# EasyEDA Pro project STM32-Environment-Monitor-V1.2.epro

# Schematic Schematic1

## Sheets
1 P1: Assembly Variant: Basic; Board Name: Board1; Create Date: 2026-11-14; Page Name: P1; Project Name: 基于STM32的多功能环境智能监控系统; Schematic Name: Schematic1; Update Date: 2026-11-14; Company: 嘉立创EDA; Page Size: A4; Version: V1.0
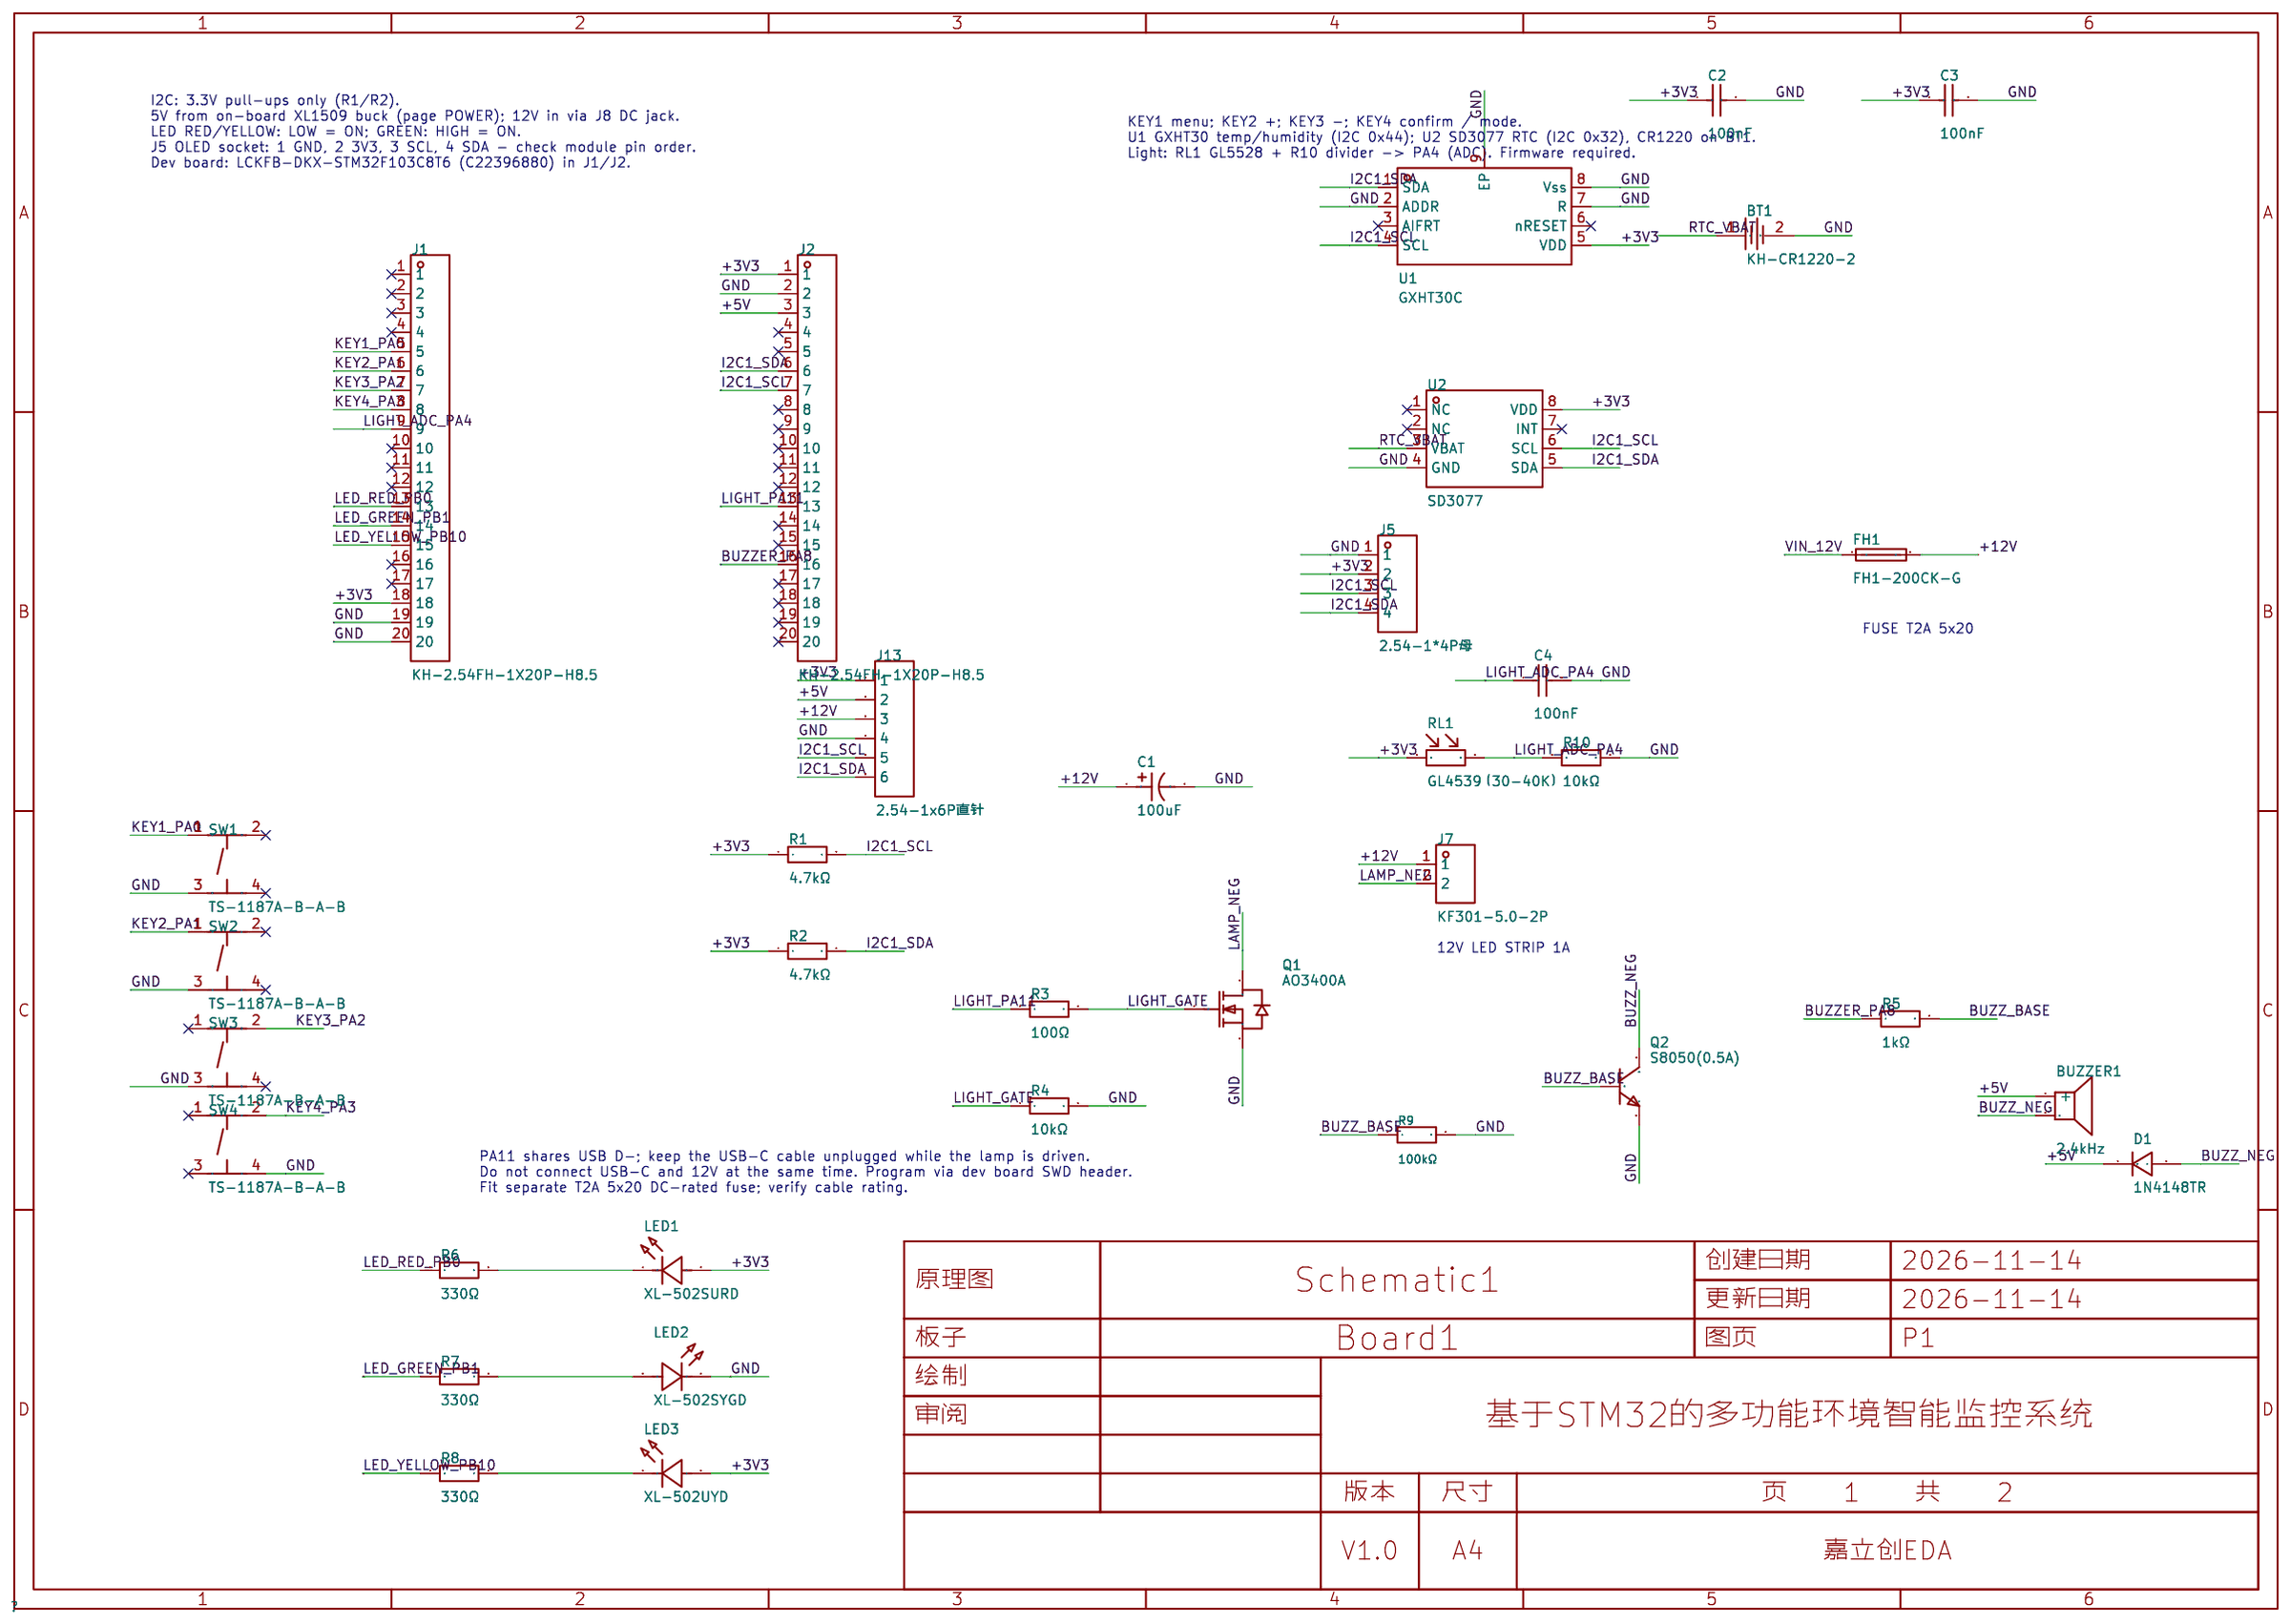
[diagram p0: P1]
2 POWER: Create Date: 2026-11-13; Page Name: POWER; Update Date: 2026-11-13
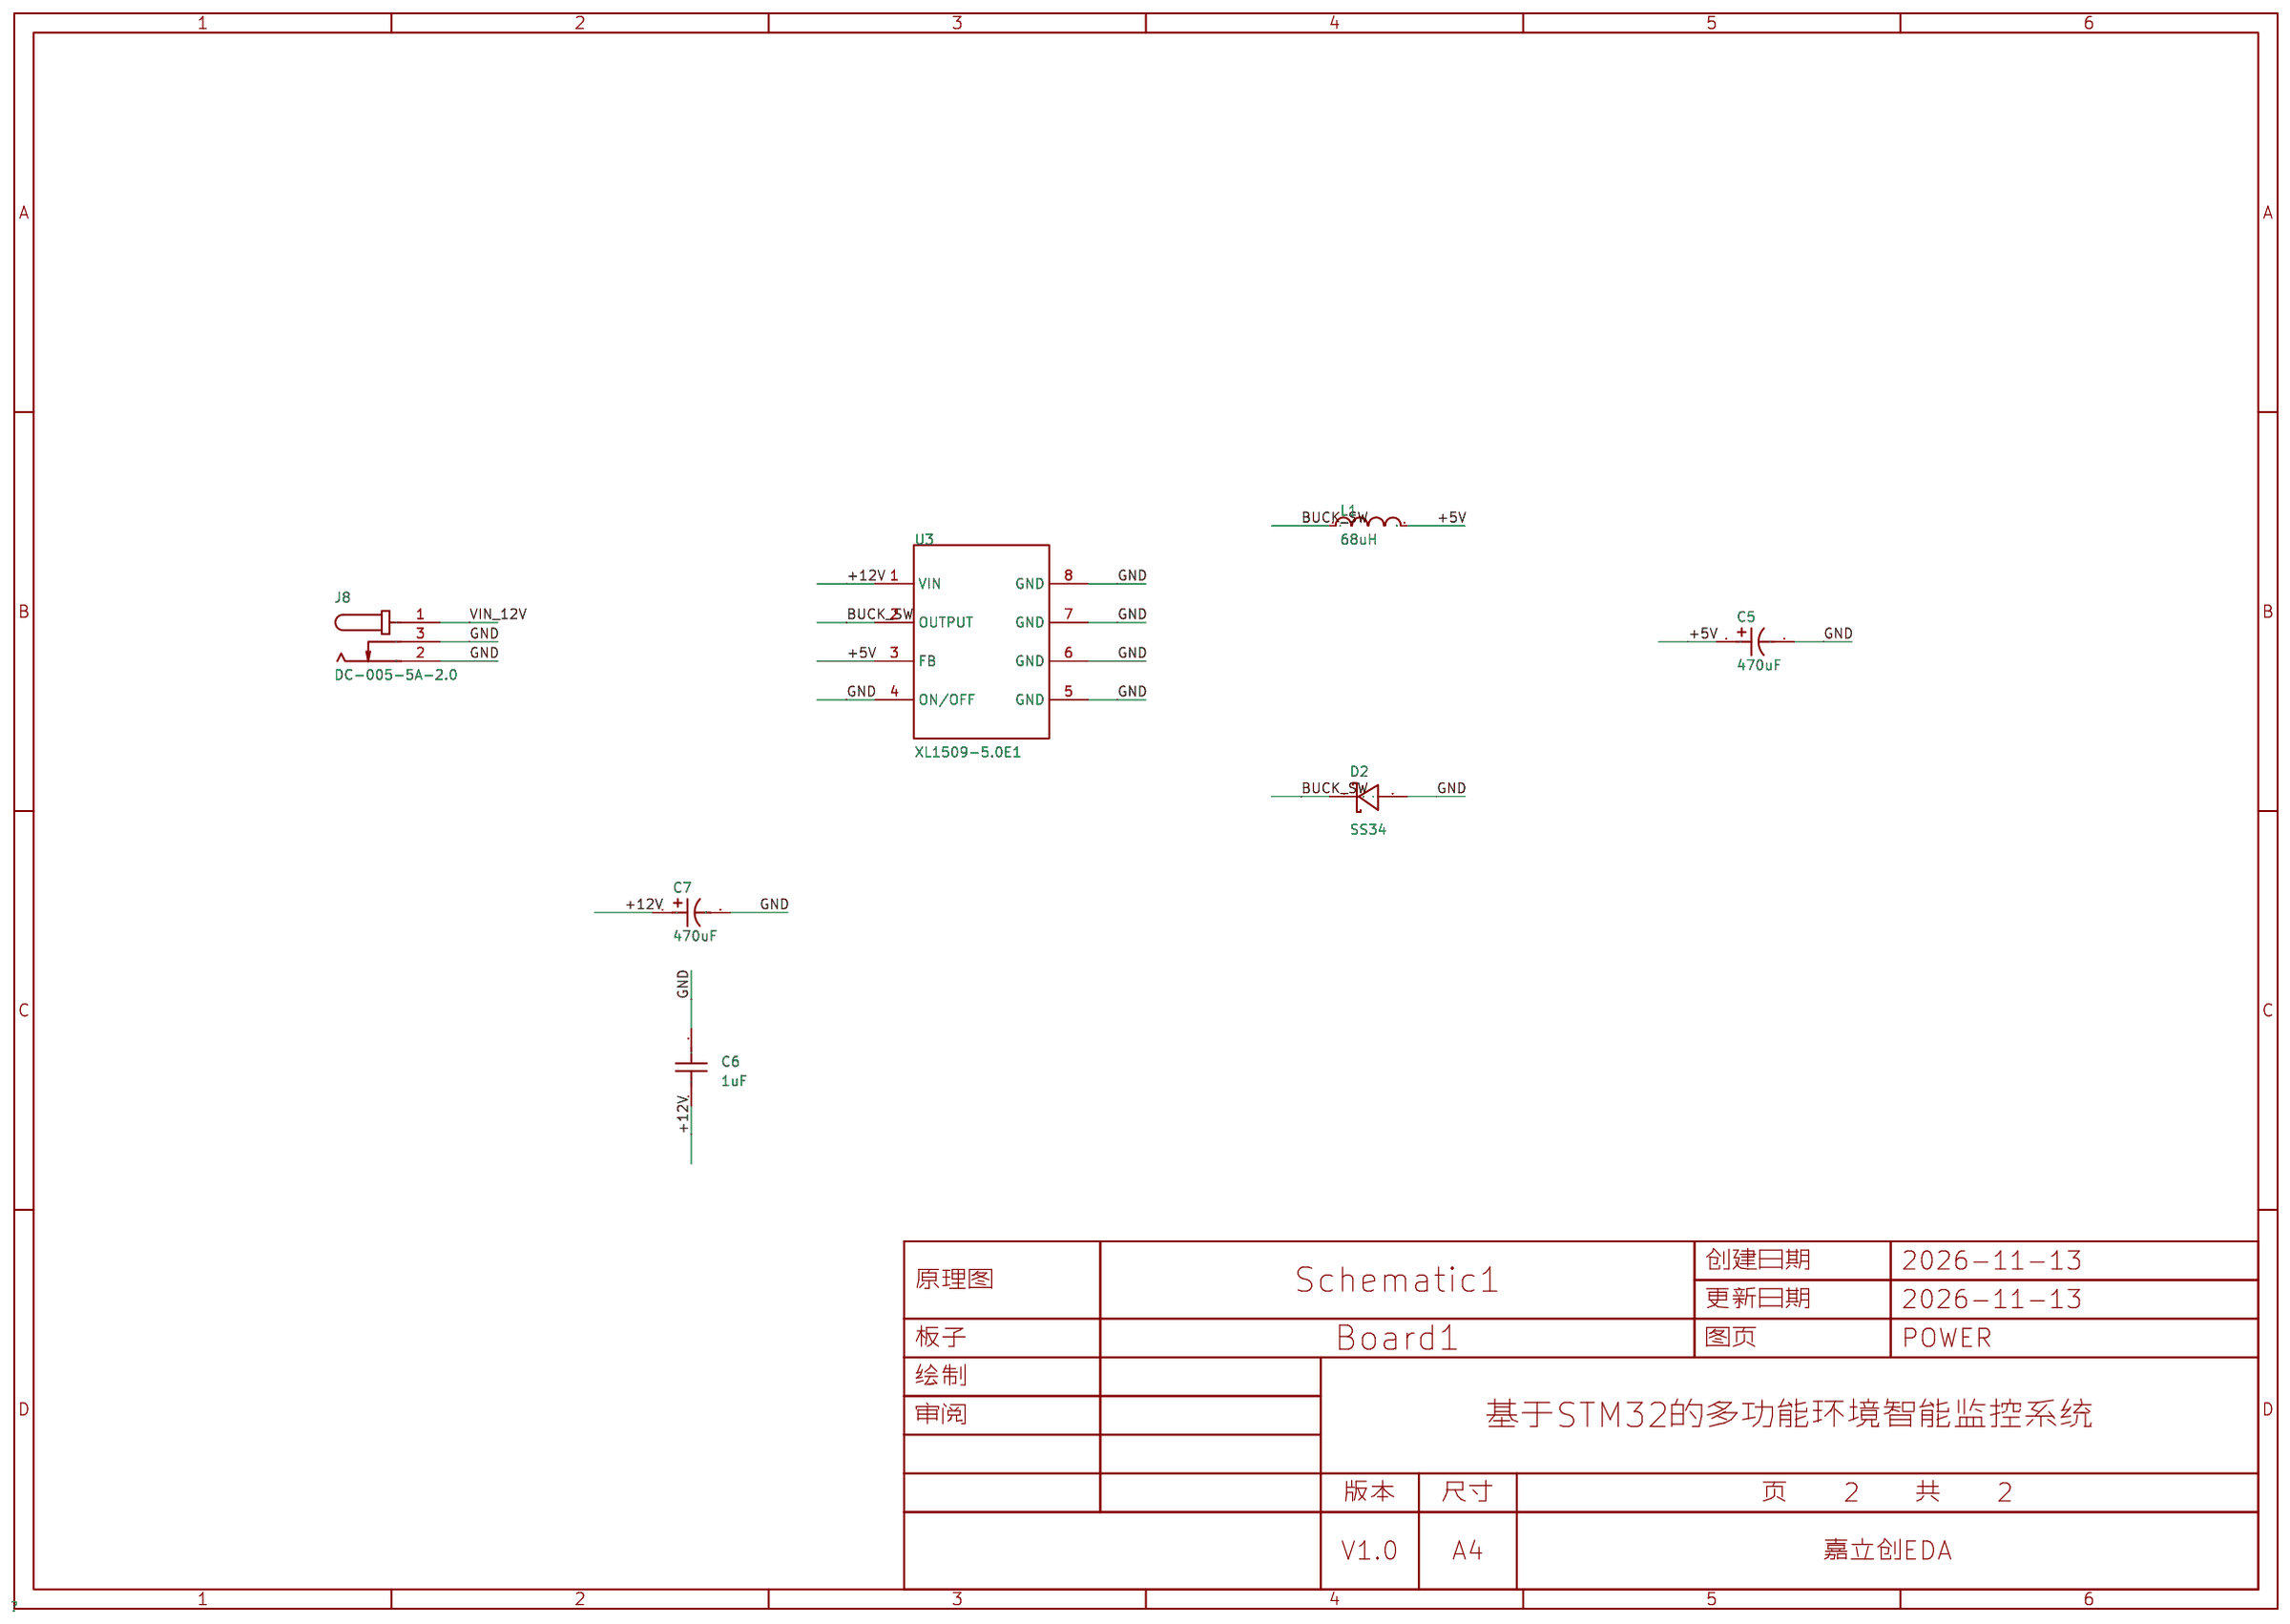
[diagram p1: POWER]

## Parts
sheet P1
BT1  KH-CR1220-2  [BAT-SMD_CR1220-2]
BUZZER1  2.4kHz  [BUZ-TH_BD12.0-P7.60-D0.6-FD]
C1  100uF  [CAP-TH_BD6.3-P2.50-D0.5-FD]
C2  100nF  [C0603]
C3  100nF  [C0603]
C4  100nF  [C0603]
D1  1N4148TR  [DO-35_BD2.0-L4.2-P8.20-D0.5-RD]
FH1  FH1-200CK-G  [FUSE-TH_L24.8-W9.8-P22.60]
J1  KH-2.54FH-1X20P-H8.5  [HDR-TH_20P-P2.54-V-F-2]
J2  KH-2.54FH-1X20P-H8.5  [HDR-TH_20P-P2.54-V-F-2]
J5  2.54-1*4P母  [HDR-TH_4P-P2.54-V-F]
J7  KF301-5.0-2P  [CONN-TH_P5.00_KF301-5.0-2P]
J13  2.54-1x6P直针  [HDR-TH_6P-P2.54-V-M-1]
LED1  XL-502SURD  [LED-TH_BD5.9-P2.54-RD_RED]
LED2  XL-502SYGD  [LED-TH_BD5.8-P2.54-RD]
LED3  XL-502UYD  [LED-TH_BD5.9-P2.54-RD_YELLOW]
Q1  AO3400A  [SOT-23-3_L2.9-W1.3-P1.90-LS2.4-BR]
Q2  S8050(0.5A)  [SOT-23-3_L2.9-W1.3-P1.90-LS2.4-BR]
R1  4.7kΩ  [R0603]
R2  4.7kΩ  [R0603]
R3  100Ω  [R0603]
R4  10kΩ  [R0603]
R5  1kΩ  [R0603]
R6  330Ω  [R0603]
R7  330Ω  [R0603]
R8  330Ω  [R0603]
R9  100kΩ  [R0603]
R10  10kΩ  [R0603]
RL1  GL4539（30-40K）  [CAP-TH_BD6.3-P2.50-D0.5-FD]
SW1  TS-1187A-B-A-B  [SW-SMD_4P-L5.1-W5.1-P3.70-LS6.5-TL_H1.5]
SW2  TS-1187A-B-A-B  [SW-SMD_4P-L5.1-W5.1-P3.70-LS6.5-TL_H1.5]
SW3  TS-1187A-B-A-B  [SW-SMD_4P-L5.1-W5.1-P3.70-LS6.5-TL_H1.5]
SW4  TS-1187A-B-A-B  [SW-SMD_4P-L5.1-W5.1-P3.70-LS6.5-TL_H1.5]
U1  GXHT30C  [DFN-8_L2.5-W2.5-P0.50-BL-EP]
U2  SD3077  [SOIC-8_L5.3-W5.3-P1.27-LS8.0-BL]
sheet POWER
C5  470uF  [CAP-SMD_BD10.0-L10.3-W10.3-LS11.3-FD]
C6  1uF  [C0805]
C7  470uF  [CAP-SMD_BD10.0-L10.3-W10.3-LS11.3-FD]
D2  SS34  [SMA_L4.3-W2.6-LS5.0-RD]
J8  DC-005-5A-2.0  [DC-IN-TH_DC-005-5A-2.0]
L1  68uH  [IND-SMD_L8.0-W8.0_SMNR8040]
U3  XL1509-5.0E1  [SOIC-8_L5.0-W4.0-P1.27-LS6.0-BL]

## Library data of the parts
BT1 = KH-CR1220-2: PPS BS-1220-2贴片正负极带孔6号模; Supplier Part: C5365933; Manufacturer: kinghelm(金航标); JLCPCB Part Class: 扩展库; Datasheet: https://atta.szlcsc.com/upload/public/pdf/source/20230301/1E62885793E6CFB75C333AA3D0BD606A.pdf; Supplier: LCSC; PCB Layer: Default
BUZZER1 = TMB12A05_C96093: 驱动方式:有源(内含驱动线路);构造类型:电磁式;额定电压:5V;频率:2.4kHz;声压(SPL):85dB;; LCSC Part Name: 有源(内含驱动线路) 电磁式 2.4kHz; Supplier Part: C96093; Manufacturer: 华能; Manufacturer Part: TMB12A05; Supplier Footprint: 插件,D=12mm; JLCPCB Part Class: Extended Part; Datasheet: https://item.szlcsc.com/datasheet/TMB12A05/97297.html; Supplier: LCSC; Driver Circuitry: 有源(内含驱动线路); Technology: 电磁式; Voltage Rating: 5V; Voltage - Supply: 4V~8V; Current Consumption: 30mA; Sound Pressure Level(SPL): 85dB; Diameter(φD): 12mm; Height: 9.8mm; Operating Temperature: -40℃~+85℃; Mounting Type: 插件
C1 = ERG25V100M6X7: 容值:100uF;精度:±20%;额定电压:25V;纹波电流:205mA@100kHz;等效串联电阻(ESR):600mΩ@100kHz;; LCSC Part Name: 100uF ±20% 25V; Supplier Part: C48935385; Manufacturer: JIERR(捷而瑞); Supplier Footprint: 插件,D6.3xL7mm; JLCPCB Part Class: Extended Part; Datasheet: https://item.szlcsc.com/datasheet/ERG25V100M6X7/51248505.html; Supplier: LCSC; Tolerance: ±20%; Voltage Rating: 25V; Ripple Current: 205mA@100kHz; Equivalent Series Resistance(ESR): 600mΩ@100kHz; Pin Spacing: 2.5mm; Diameter: 6.3mm; Height - Seated (Max): 7mm; Lifetime: 2000hrs@105℃; Operating Temperature: -40℃~+105℃; Polarity type: 有极性
C2-C4 = 0603B104K500NT: 容值:100nF;精度:±10%;额定电压:50V;材质(温度系数):X7R;; LCSC Part Name: 100nF ±10% 50V; Supplier Part: C30926; Manufacturer: FH(风华); Supplier Footprint: 0603; JLCPCB Part Class: Extended Part; Datasheet: https://atta.szlcsc.com/upload/public/pdf/source/20170923/C30926_1506149436298988724.pdf; Supplier: LCSC; Tolerance: ±10%; Voltage Rated: 50V; Temperature Coefficient: X7R; PCB Layer: Default
D1 = 1N4148TR_C84410: 二极管配置:1个独立式;整流电流:200mA;直流反向耐压(Vr):100V;正向压降(Vf):1V@10mA;反向恢复时间(Trr):4ns;; LCSC Part Name: 100V 200mA; Supplier Part: C84410; Manufacturer: onsemi(安森美); Supplier Footprint: DO-35; JLCPCB Part Class: Extended Part; Datasheet: https://item.szlcsc.com/datasheet/1N4148TR/85580.html; Supplier: LCSC; Diode Configuration: 1个独立式; Pd - Power Dissipation: 500mW; Current - Rectified: 200mA; Voltage - DC Reverse(Vr): 100V; Voltage - Forward(Vf@If): 1V@10mA; Non-Repetitive Peak Forward Surge Current: 4A; Reverse Leakage Current (Ir): 5uA@75V; Reverse Recovery Time (trr): 4ns; Operating Junction Temperature Range: -55℃~+175℃@(Tj)
FH1 = FH1-200CK-G: 保险丝座类型:-;保险丝类型:-;; LCSC Part Name: 两件套 保险丝夹5*20绿色（两件套）; Supplier Part: C268204; Manufacturer: HONGJU(宏聚); Supplier Footprint: 插件,P=22.6mm; JLCPCB Part Class: Extended Part; Datasheet: https://item.szlcsc.com/datasheet/FH1-200CK-G/257711.html; Supplier: LCSC; PCB Layer: Default
J1 J2 = KH-2.54FH-1X20P-H8.5: 插孔结构:1x20P;间距:2.54mm;行距:-;圆孔/方孔:方孔;安装方式:直插;排数:单排;总孔位数:20P;额定电流:3A;额定电压:-;插孔方向:顶部;塑高:8.5mm;触头材质:黄铜;触头镀层:金;工作温度:-40℃~+105℃;; LCSC Part Name: 1x20P 间距:2.54mm 直插; Supplier Part: C2905423; Manufacturer: kinghelm(金航标); Supplier Footprint: 插件,P=2.54mm; JLCPCB Part Class: Extended Part; Datasheet: https://item.szlcsc.com/datasheet/KH-2.54FH-1X20P-H8.5/3175197.html; Supplier: LCSC; Holes Structure: 1x20P; Pitch: 2.54mm; Circular Hole / Square Hole: 方孔; Mounting Type: 直插; Number of Rows: 单排; Number of Positions: 20P; Current Rating: 3A; Holes Direction: 顶部; Insulation Height: 8.5mm; Contact Material: 黄铜; Contact Plating: 金; Operating Temperature: -40℃~+105℃; PIN Length: 3mm
J5 = 2.54-1*4P母: 排数:单排;总孔位数:4P;间距:2.54mm;插孔结构:1x4P;行距:-;安装类型:直插;圆孔/方孔:方孔;额定电流:3A;额定电压:-;插孔方向:顶部;塑高:-;触头材质:青铜;触头镀层:-;工作温度范围:-40℃~+105℃;焊接温度(最大值):-;; LCSC Part Name: 间距:2.54mm 1x4P 直插; Supplier Part: C2718488; Manufacturer: BOOMELE(博穆精密); Supplier Footprint: 插件,P=2.54mm; JLCPCB Part Class: Extended Part; Datasheet: https://atta.szlcsc.com/upload/public/pdf/source/20210301/C2718488_F4427B881E42CAA8DDB0B1C12B3A522C.pdf; Supplier: LCSC; Number of Rows: 单排; Number of Holes: 4P; Pitch: 2.54mm; Holes Structure: 1x4P; Mounting Type: 直插; Circular Hole / Square Hole: 方孔; Current Rating (Max): 3A; Holes Direction: 顶部; Contact Material: 青铜; Operating Temperature Range: -40℃~+105℃; PCB Layer: Default
J7 = KF301-5.0-2P: 结构:1x2P;间距:5mm;颜色:蓝色;安装类型:直插;排数:1;每排PIN数:2;额定电流:17A;额定电压:250V;线规 - AWG:14~22;线规 - 平方毫米:1.5;工作温度:-30℃~+120℃;; LCSC Part Name: 1x2P 5mm 直插 排数:1 每排P数:2; Supplier Part: C474881; Manufacturer: KEFA(科发); Supplier Footprint: 插件,P=5mm; JLCPCB Part Class: Extended Part; Datasheet: https://item.szlcsc.com/datasheet/KF301-5.0-2P/481499.html; Supplier: LCSC; Number of Positions or Pins: 1x2P; Pitch: 5mm; Color: 蓝色; Mounting Type: 直插; Number of Pins: 2P; Number of Rows: 1; Number of PINs Per Row: 2; Screw Specification: M2.5; Current Rating: 17A; Voltage Rating (Max): 250V; Wire Gauge - AWG: 14~22; Wire Gauge - mm2: 1.5; Operating Temperature: -30℃~+120℃; Height Above Board: 10mm; PCB Layer: Default
J13 = 2.54-1x6P直针: 插针结构:1x6P;间距:2.54mm;行距:-;圆针/方针:方针;安装方式:直插;排数:单排;总PIN位数:6P;额定电流:3A;额定电压:-;配合针长度:5.7mm;塑高:2.5mm;端接针长度:3mm;触头材质:黄铜;触头镀层:金;工作温度:-40℃~+105℃;颜色:黑色;; LCSC Part Name: 1x6P 间距:2.54mm 方针 直插; Supplier Part: C37208; Manufacturer: BOOMELE(博穆精密); Supplier Footprint: 插件,P=2.54mm; JLCPCB Part Class: Extended Part; Datasheet: https://item.szlcsc.com/datasheet/2.54-1x6P%25E7%259B%25B4%25E9%2592%2588/38187.html; Supplier: LCSC; Pin Structure: 1x6P; Pitch: 2.54mm; Circluar Pins/Square Pins: 方针; Mounting Type: 直插; Number of Rows: 单排; Number of Pins: 6P; Current Rating: 3A; Length of Mating Pin: 5.7mm; Insulation Height: 2.5mm; Length of End Connection Pin: 3mm; Contact Material: 黄铜; Contact Plating: 金; Operating Temperature: -40℃~+105℃; Color: 黑色
LED1 = XL-502SURD: 灯头类型:5mm圆形灯头;发光颜色:红色;正向压降(Vf):2.4V;功率:70mW;测试电流:20mA;波长:615nm~625nm;二极管配置:-;透镜颜色:红色透镜;色温:-;发光强度:300mcd;发光角度:35°;载带方式:-;工作温度:-25℃~+85℃;; LCSC Part Name: 5mm圆形灯头 红色; Supplier Part: C2895492; Manufacturer: XINGLIGHT(成兴光); Supplier Footprint: 插件,D=5mm; JLCPCB Part Class: Extended Part; Datasheet: https://item.szlcsc.com/datasheet/XL-502SURD/3136207.html; Supplier: LCSC; Lamp Holder Type: 5mm圆形灯头; Illumination Color: 红色; Voltage - Forward(Vf): 2.4V; Power(Watts): 70mW; Test Current: 20mA; Wavelength - Dominant: 615nm~625nm; Peak Wavelength: 654nm; Lens Color: 红色透镜; Luminous Intensity: 300mcd; Viewing Angle: 35°; Operating Temperature: -25℃~+85℃
LED2 = XL-502SYGD: 灯头类型:5mm圆形灯头;发光颜色:黄绿色;正向压降(Vf):2.3V;功率:50mW;正向电流:20mA;波长:560nm~580nm;二极管配置:-;透镜颜色:绿色透镜;色温:-;发光强度:300mcd;发光角度:25°;载带方式:-;工作温度:-20℃~+85℃;; LCSC Part Name: 绿发普绿短脚; Supplier Part: C2895550; Manufacturer: XINGLIGHT(成兴光); Supplier Footprint: 插件,D=5mm; JLCPCB Part Class: Extended Part; Datasheet: https://item.szlcsc.com/datasheet/XL-502SYGD/3136215.html; Supplier: LCSC; Lamp Holder Type: 5mm圆形灯头; Illumination Color: 黄绿色; Voltage - Forward(Vf): 2.3V; Power(Watts): 50mW; Forward Current: 20mA; Wavelength - Dominant: 560nm~580nm; Peak Wavelength: 570nm; Lens Color: 绿色透镜; Luminous Intensity: 300mcd; Viewing Angle: 25°; Operating Temperature: -20℃~+85℃
LED3 = XL-502UYD: 灯头类型:5mm圆形灯头;发光颜色:黄色;正向压降(Vf):2.2V;功率:50mW;正向电流:20mA;波长:585nm~595nm;二极管配置:-;透镜颜色:黄色透镜;色温:-;发光强度:1cd;发光角度:25°;载带方式:-;工作温度:-20℃~+85℃;; LCSC Part Name: 5mm圆形灯头 黄色; Supplier Part: C2895494; Manufacturer: XINGLIGHT(成兴光); Supplier Footprint: 插件,D=5mm; JLCPCB Part Class: Extended Part; Datasheet: https://item.szlcsc.com/datasheet/XL-502UYD/3136209.html; Supplier: LCSC; Lamp Holder Type: 5mm圆形灯头; Illumination Color: 黄色; Voltage - Forward(Vf): 2.2V; Power(Watts): 50mW; Forward Current: 20mA; Wavelength - Dominant: 585nm~595nm; Peak Wavelength: 588nm; Lens Color: 黄色透镜; Luminous Intensity: 1cd; Viewing Angle: 25°; Operating Temperature: -20℃~+85℃
Q1 = AO3400A_C20917: 数量:1个N沟道;漏源电压(Vdss):30V;连续漏极电流(Id):5.7A;导通电阻(RDS(on)):48mΩ@2.5V;耗散功率(Pd):1.4W;阈值电压(Vgs(th)):1.45V;; LCSC Part Name: N沟道 耐压:30V; Supplier Part: C20917; Manufacturer: AOS; Supplier Footprint: SOT-23; JLCPCB Part Class: Basic Part; Datasheet: https://item.szlcsc.com/datasheet/AO3400A/21629.html; Supplier: LCSC; Number: 1个N沟道; Drain to Source Voltage: 30V; Current - Continuous Drain(Id): 5.7A; RDS(on): 48mΩ@2.5V; Pd - Power Dissipation: 1.4W; Gate Threshold Voltage (Vgs(th)): 1.45V; Gate Charge(Qg): 7nC@10V; Input Capacitance(Ciss): 630pF; Reverse Transfer Capacitance (Crss@Vds): 50pF; Operating Temperature: -55℃~+150℃; Type: N沟道; Output Capacitance(Coss): 75pF; Vgs: ±12V
Q2 = S8050(0.5A): 晶体管类型:NPN;集电极电流(Ic):500mA;集射极击穿电压(Vceo):25V;耗散功率(Pd):300mW;直流电流增益(hFE):120;; LCSC Part Name: 电流:0.5A 电压:25V; Supplier Part: C3014350; Manufacturer: EIC; Supplier Footprint: SOT-23; JLCPCB Part Class: Extended Part; Datasheet: https://item.szlcsc.com/datasheet/S8050(0.5A)/3524496.html; Supplier: LCSC; type: NPN; Current - Collector(Ic): 500mA; Collector - Emitter Voltage VCEO: 25V; Pd - Power Dissipation: 300mW; DC Current Gain: 120; Transition frequency(fT): 150MHz; Current - Collector Cutoff: 100nA; Vce Saturation(VCE(sat)): 600mV; Emitter-Base Voltage(Vebo): 5V; Number: 1个NPN; Configuration: 独立式
R1 R2 = 0603WAF4701T5E: 电阻类型:厚膜电阻;阻值:4.7kΩ;精度:±1%;功率:100mW;工作电压:75V;温度系数:±100ppm/℃;; LCSC Part Name: 厚膜电阻 4.7kΩ ±1%; Supplier Part: C23162; Manufacturer: UNI-ROYAL(厚声); Supplier Footprint: 0603; JLCPCB Part Class: Basic Part; Datasheet: https://item.szlcsc.com/datasheet/0603WAF4701T5E/23889.html; Supplier: LCSC; Type: 厚膜电阻; Tolerance: ±1%; Power(Watts): 100mW; Voltage-Supply(Max): 75V; Temperature Coefficient: ±100ppm/℃; Operating Temperature: -55℃~+155℃
R3 = 0603WAF1000T5E: 电阻类型:厚膜电阻;阻值:100Ω;精度:±1%;功率:100mW;最大工作电压:75V;温度系数:±200ppm/℃;; LCSC Part Name: 100Ω ±1% 100mW 厚膜电阻; Supplier Part: C22775; Manufacturer: UNI-ROYAL(厚声); Supplier Footprint: 0603; JLCPCB Part Class: Basic Part; Datasheet: https://atta.szlcsc.com/upload/public/pdf/source/20200306/C422600_1E6D84923E4A46A82E41ADD87F860B5C.pdf; Supplier: LCSC; Type: 厚膜电阻; Tolerance: ±1%; Power(Watts): 100mW; Overload Voltage (Max): 75V; Temperature Coefficient: ±200ppm/℃; Operating Temperature Range: -55℃~+155℃
R4 = 0603WAF1002T5E: 电阻类型:厚膜电阻;阻值:10kΩ;精度:±1%;功率:100mW;工作电压:75V;温度系数:±100ppm/℃;; LCSC Part Name: 厚膜电阻 10kΩ ±1% 100mW; Supplier Part: C25804; Manufacturer: UNI-ROYAL(厚声); Supplier Footprint: 0603; JLCPCB Part Class: Basic Part; Datasheet: https://item.szlcsc.com/datasheet/0603WAF1002T5E/26547.html; Supplier: LCSC; Type: 厚膜电阻; Tolerance: ±1%; Power(Watts): 100mW; Voltage-Supply(Max): 75V; Temperature Coefficient: ±100ppm/℃; Operating Temperature: -55℃~+155℃
R5 = 0603WAF1001T5E: 电阻类型:厚膜电阻;阻值:1kΩ;精度:±1%;功率:100mW;工作电压:75V;温度系数:±100ppm/℃;; LCSC Part Name: 1kΩ ±1% 100mW 厚膜电阻; Supplier Part: C21190; Manufacturer: UNI-ROYAL(厚声); Supplier Footprint: 0603; JLCPCB Part Class: Basic Part; Datasheet: https://item.szlcsc.com/datasheet/0603WAF1001T5E/21904.html; Supplier: LCSC; Type: 厚膜电阻; Tolerance: ±1%; Power(Watts): 100mW; Voltage-Supply(Max): 75V; Temperature Coefficient: ±100ppm/℃; Operating Temperature: -55℃~+155℃
R6-R8 = 0603WAF3300T5E: 电阻类型:厚膜电阻;阻值:330Ω;精度:±1%;功率:100mW;最大工作电压:75V;温度系数:±100ppm/℃;; LCSC Part Name: 330Ω ±1% 100mW 厚膜电阻; Supplier Part: C23138; Manufacturer: UNI-ROYAL(厚声); Supplier Footprint: 0603; JLCPCB Part Class: Basic Part; Datasheet: https://atta.szlcsc.com/upload/public/pdf/source/20200306/C422600_1E6D84923E4A46A82E41ADD87F860B5C.pdf; Supplier: LCSC; Type: 厚膜电阻; Tolerance: ±1%; Power(Watts): 100mW; Overload Voltage (Max): 75V; Temperature Coefficient: ±100ppm/℃; Operating Temperature Range: -55℃~+155℃
R9 = 0603WAF1003T5E: 电阻类型:厚膜电阻;阻值:100kΩ;精度:±1%;功率:100mW;工作电压:75V;温度系数:±100ppm/℃;; LCSC Part Name: 厚膜电阻 100kΩ ±1% 100mW; Supplier Part: C25803; Manufacturer: UNI-ROYAL(厚声); Supplier Footprint: 0603; JLCPCB Part Class: Basic Part; Datasheet: https://item.szlcsc.com/datasheet/0603WAF1003T5E/26546.html; Supplier: LCSC; Type: 厚膜电阻; Tolerance: ±1%; Power(Watts): 100mW; Voltage-Supply(Max): 75V; Temperature Coefficient: ±100ppm/℃; Operating Temperature: -55℃~+155℃
R10 = 0603WAF1002T5E: 电阻类型:厚膜电阻;阻值:10kΩ;精度:±1%;功率:100mW;最大工作电压:75V;温度系数:±100ppm/℃;; LCSC Part Name: 厚膜电阻 10kΩ ±1% 100mW; Supplier Part: C25804; Manufacturer: UNI-ROYAL(厚声); Supplier Footprint: 0603; JLCPCB Part Class: Basic Part; Datasheet: https://atta.szlcsc.com/upload/public/pdf/source/20200306/C422600_1E6D84923E4A46A82E41ADD87F860B5C.pdf; Supplier: LCSC; Type: 厚膜电阻; Tolerance: ±1%; Power(Watts): 100mW; Overload Voltage (Max): 75V; Temperature Coefficient: ±100ppm/℃; Operating Temperature Range: -55℃~+155℃; PCB Layer: Default
RL1 = GL4539（30-40K）: 暗电阻:10MΩ;亮电阻@10Lux:30kΩ~40kΩ;光谱峰值(波长):540nm;; Supplier Part: C11295; Manufacturer: JCHL(晶创和立); Supplier Footprint: 插件,P=2.5mm; JLCPCB Part Class: Extended Part; Datasheet: https://item.szlcsc.com/datasheet/GL4539%25EF%25BC%258830-40K%25EF%25BC%2589/11848.html; Supplier: LCSC; Dark Resistance: 10MΩ; Cell Resistance @ Illuminance: 30kΩ~40kΩ; Voltage - Max: 150V; Wavelength - Peak: 540nm; PCB Layer: Default
SW1-SW4 = TS-1187A-B-A-B: 电路结构:单刀单掷;按钮形状:圆形按钮;作用力:1.6N;安装方式:立贴;开关长度:5.1mm;开关宽度:5.1mm;开关高度:1.5mm;带支架:不带支架;触点电流:50mA;额定电压:12V;带灯:无;工作寿命:10万次;; LCSC Part Name: 5.1*5.1*1.5mm 立贴 轻触开关; Supplier Part: C318884; Manufacturer: XKB Connection(中国星坤); Supplier Footprint: SMD-4P,5.1x5.1mm; JLCPCB Part Class: Basic Part; Datasheet: https://item.szlcsc.com/datasheet/TS-1187A-B-A-B/299976.html; Supplier: LCSC; Circuit: 单刀单掷; Actuator Style: 圆形按钮; Operating Force: 1.6N; Mounting Type: 立贴; Length: 5.1mm; Width: 5.1mm; Switch Height: 1.5mm; with Bracket: 不带支架; Contact Current: 50mA; Voltage Rating: 12V; Actuator/Cap Color: 金色; With Lamp: 无; Life: 10万次; Operating Temperature: -30℃~+85℃
U1 = GXHT30: Supplier Part: C2913569; Manufacturer: GXCAS(中科银河芯); Supplier Footprint: DFN-8; JLCPCB Part Class: 扩展库; Datasheet: https://atta.szlcsc.com/upload/public/pdf/source/20210421/C2758005_1AAAA4DD875C189861E5CD415617BEF2.pdf; Supplier: LCSC; NO_CONNECT: yes; PCB Layer: Default
U2 = SD3077_C4748679: 内置晶振,管脚兼容3068,8010，IIC接口，低功耗常温±3.8PPM可以全温度范围补偿，工作电压2.7V-5.5V,工作温度-40℃-+85℃,内置70字节寄存器，32.768HZ方波输出，具备充电功能及电池电压测量功能; LCSC Part Name: 时钟芯片/RTC/实时时钟; Supplier Part: C4748679; Manufacturer: WAVE(兴威帆电子); Supplier Footprint: SOP-8-208mil; JLCPCB Part Class: Extended Part; Datasheet: https://atta.szlcsc.com/upload/public/pdf/source/20220715/395BC7D7A5123EBD10B70F46DE8D6673.pdf; Supplier: LCSC; PCB Layer: Default
C5 C7 = RVE470UF35V167RV084: 容值:470uF;精度:±20%;额定电压:35V;纹波电流:670mA@120Hz;等效串联电阻(ESR):230mΩ@100kHz;; LCSC Part Name: 470uF ±20% 35V; Supplier Part: C5155332; Manufacturer: KNSCHA(科尼盛); Supplier Footprint: SMD,D10.2xL10.2mm; JLCPCB Part Class: Extended Part; Datasheet: https://item.szlcsc.com/datasheet/RVE470UF35V167RV084/5785007.html; Supplier: LCSC; Tolerance: ±20%; Voltage Rating: 35V; Ripple Current: 670mA@120Hz; Equivalent Series Resistance(ESR): 230mΩ@100kHz; Diameter: 10.2mm; Height - Seated (Max): 10.2mm; Lifetime: 2000hrs@105℃; Operating Temperature: -55℃~+105℃; Polarity type: 有极性; PCB Layer: Default
C6 = CT41G-0805-2X1-50V-1uF-K(N): 容值:1uF;精度:±10%;额定电压:50V;温度系数:-;; LCSC Part Name: 1uF ±10% 50V; Supplier Part: C141772; Manufacturer: TORCH(火炬); Supplier Footprint: 0805; JLCPCB Part Class: Extended Part; Datasheet: https://item.szlcsc.com/datasheet/CT41G-0805-2X1-50V-1uF-K(N)/153103.html; Supplier: LCSC; Tolerance: ±10%; Voltage Rating: 50V; PCB Layer: Default
D2 = SS34: Supplier Part: C8678; Manufacturer: MDD(辰达半导体); Supplier Footprint: SMA,DO-214AC; JLCPCB Part Class: Extended Part; Supplier: LCSC; PCB Layer: Default
J8 = DC-005-5A-2.0: 连接器类型:DC电源插座;安装方式:弯插;触点内径:2mm;触点外径:6.2mm;额定电流:5A;额定电压:24V;工作温度:-20℃~+70℃;; LCSC Part Name: DC电源插座 内径:2mm 外径:6.2mm; Supplier Part: C381116; Manufacturer: XKB Connection(中国星坤); Supplier Footprint: 插件; JLCPCB Part Class: Extended Part; Datasheet: https://item.szlcsc.com/datasheet/DC-005-5A-2.0/353348.html; Supplier: LCSC; Connector Type: DC电源插座; Mounting Type: 弯插; Inside Contact Diameter: 2mm; Outside Contact Diameter: 6.2mm; Current Rating: 5A; Voltage Rating (Max): 24V; Body Height: 11mm; Length: 14mm; Width: 9mm; Operating Temperature: -20℃~+70℃; PCB Layer: Default
L1 = SWPA8040S680MT: 电感值:68uH;精度:±20%;额定电流:1.25A;饱和电流(Isat):1.45A;类型:-;; LCSC Part Name: 68uH ±20% 1.45A; Supplier Part: C36418; Manufacturer: Sunlord(顺络); Supplier Footprint: SMD,8x8mm; JLCPCB Part Class: Extended Part; Datasheet: https://item.szlcsc.com/datasheet/SWPA8040S680MT/37396.html; Supplier: LCSC; Tolerance: ±20%; Current Rating: 1.25A; Current - Saturation(Isat): 1.45A; DC Resistance(DCR): 255mΩ; Application Grade: 消费级; PCB Layer: Default
U3 = XL1509-5.0E1: 功能类型:降压型;工作电压:4.5V~40V;输出电压:5V;输出电流:2A;输出类型:固定;; LCSC Part Name: 降压型 2A 4.5V~40V; Supplier Part: C61063; Manufacturer: XLSEMI(芯龙); Supplier Footprint: SOIC-8; JLCPCB Part Class: Basic Part; Datasheet: https://item.szlcsc.com/datasheet/XL1509-5.0E1/62115.html; Supplier: LCSC; Function: 降压型; Voltage - Supply: 4.5V~40V; Output Voltage: 5V; Output Current: 2A; Frequency - Switching: 150kHz; Operating Temperature: -40℃~+85℃; Synchronous Rectifier: 否; Number of Outputs: 1; Topology: 降压式; Quiescent Current: 2mA; Switch tube (built-in/external): 内置; Output Type: 固定; Features: 过流保护; PCB Layer: Default

## Nets
+3V3: C2.1 C3.1 J1.18 J2.1 J5.2 J13.1 LED1.2(A) LED3.2(A) R1.1 R2.1 RL1.1 U1.5(VDD) U2.8(VDD)
+5V: BUZZER1.1(+) C5.1 D1.1(C) J2.3 J13.2 L1.2 U3.3(FB)
+12V: C1.1 C6.1 C7.1 FH1.2 J7.1 J13.3 U3.1(VIN)
GND: BT1.2 C1.2 C2.2 C3.2 C4.2 C5.2 C6.2 C7.2 D2.2(A) J1.19 J1.20 J2.2 J5.1 J8.2 J8.3 J13.4 LED2.1(K) Q1.2(S) Q2.2(E) R4.2 R9.2 R10.2 SW1.3(C) SW2.3(C) SW3.3(C) SW4.4(D) U1.2(ADDR) U1.7(R) U1.8(Vss) U1.9(EP) U2.4(GND) U3.4(ON/OFF) U3.5(GND) U3.6(GND) U3.7(GND) U3.8(GND)
VIN_12V: FH1.1 J8.1
BUCK_SW: D2.1(K) L1.1 U3.2(OUTPUT)
BUZZ_BASE: Q2.1(B) R5.2 R9.1
BUZZ_NEG: BUZZER1.2 D1.2(A) Q2.3(C)
BUZZER_PA8: J2.16 R5.1
I2C1_SCL: J2.7 J5.3 J13.5 R1.2 U1.4(SCL) U2.6(SCL)
I2C1_SDA: J2.6 J5.4 J13.6 R2.2 U1.1(SDA) U2.5(SDA)
KEY1_PA0: J1.5 SW1.1(A)
KEY2_PA1: J1.6 SW2.1(A)
KEY3_PA2: J1.7 SW3.2(B)
KEY4_PA3: J1.8 SW4.2(B)
LAMP_NEG: J7.2 Q1.3(D)
LED_GREEN_PB1: J1.14 R7.1
LED_RED_PB0: J1.13 R6.1
LED_YELLOW_PB10: J1.15 R8.1
LIGHT_ADC_PA4: C4.1 J1.9 R10.1 RL1.2
LIGHT_GATE: Q1.1(G) R3.2 R4.1
LIGHT_PA11: J2.13 R3.1
RTC_VBAT: BT1.1 U2.3(VBAT)
$1N72: LED1.1(K) R6.2
$1N73: LED2.2(A) R7.2
$1N74: LED3.1(K) R8.2

Not connected (* = marked no-connect by the designer): J1 1* 2* 3* 4* 10* 11* 12* 16* 17*; J2 4* 5* 8* 9* 10* 11* 12* 14* 15* 17* 18* 19* 20*; SW1 2(B)* 4(D)*; SW2 2(B)* 4(D)*; SW3 1(A)* 4(D)*; SW4 1(A)* 3(C)*; U1 3(AIFRT)* 6(nRESET)*; U2 1(NC)* 2(NC)* 7(INT)*

## Notes on the sheets
sheet 1
- I2C: 3.3V pull-ups only (R1/R2).
  5V from on-board XL1509 buck (page POWER); 12V in via J8 DC jack.
  LED RED/YELLOW: LOW = ON; GREEN: HIGH = ON.
  J5 OLED socket: 1 GND, 2 3V3, 3 SCL, 4 SDA - check module pin order.
  Dev board: LCKFB-DKX-STM32F103C8T6 (C22396880) in J1/J2.
- KEY1 menu; KEY2 +; KEY3 -; KEY4 confirm / mode.
  U1 GXHT30 temp/humidity (I2C 0x44); U2 SD3077 RTC (I2C 0x32), CR1220 on BT1.
  Light: RL1 GL5528 + R10 divider -> PA4 (ADC). Firmware required.
- FUSE T2A 5x20
- 12V LED STRIP 1A
- PA11 shares USB D-; keep the USB-C cable unplugged while the lamp is driven.
  Do not connect USB-C and 12V at the same time. Program via dev board SWD header.
  Fit separate T2A 5x20 DC-rated fuse; verify cable rating.

# Schematic Schematic2
Assembly Variant: Basic; Create Date: 2026-11-08; Page Name: P1; Project Name: 基于STM32的多功能环境智能监控系统; Schematic Name: Schematic2; Update Date: 2026-11-08; Company: 嘉立创EDA; Page Size: A4; Version: V1.0
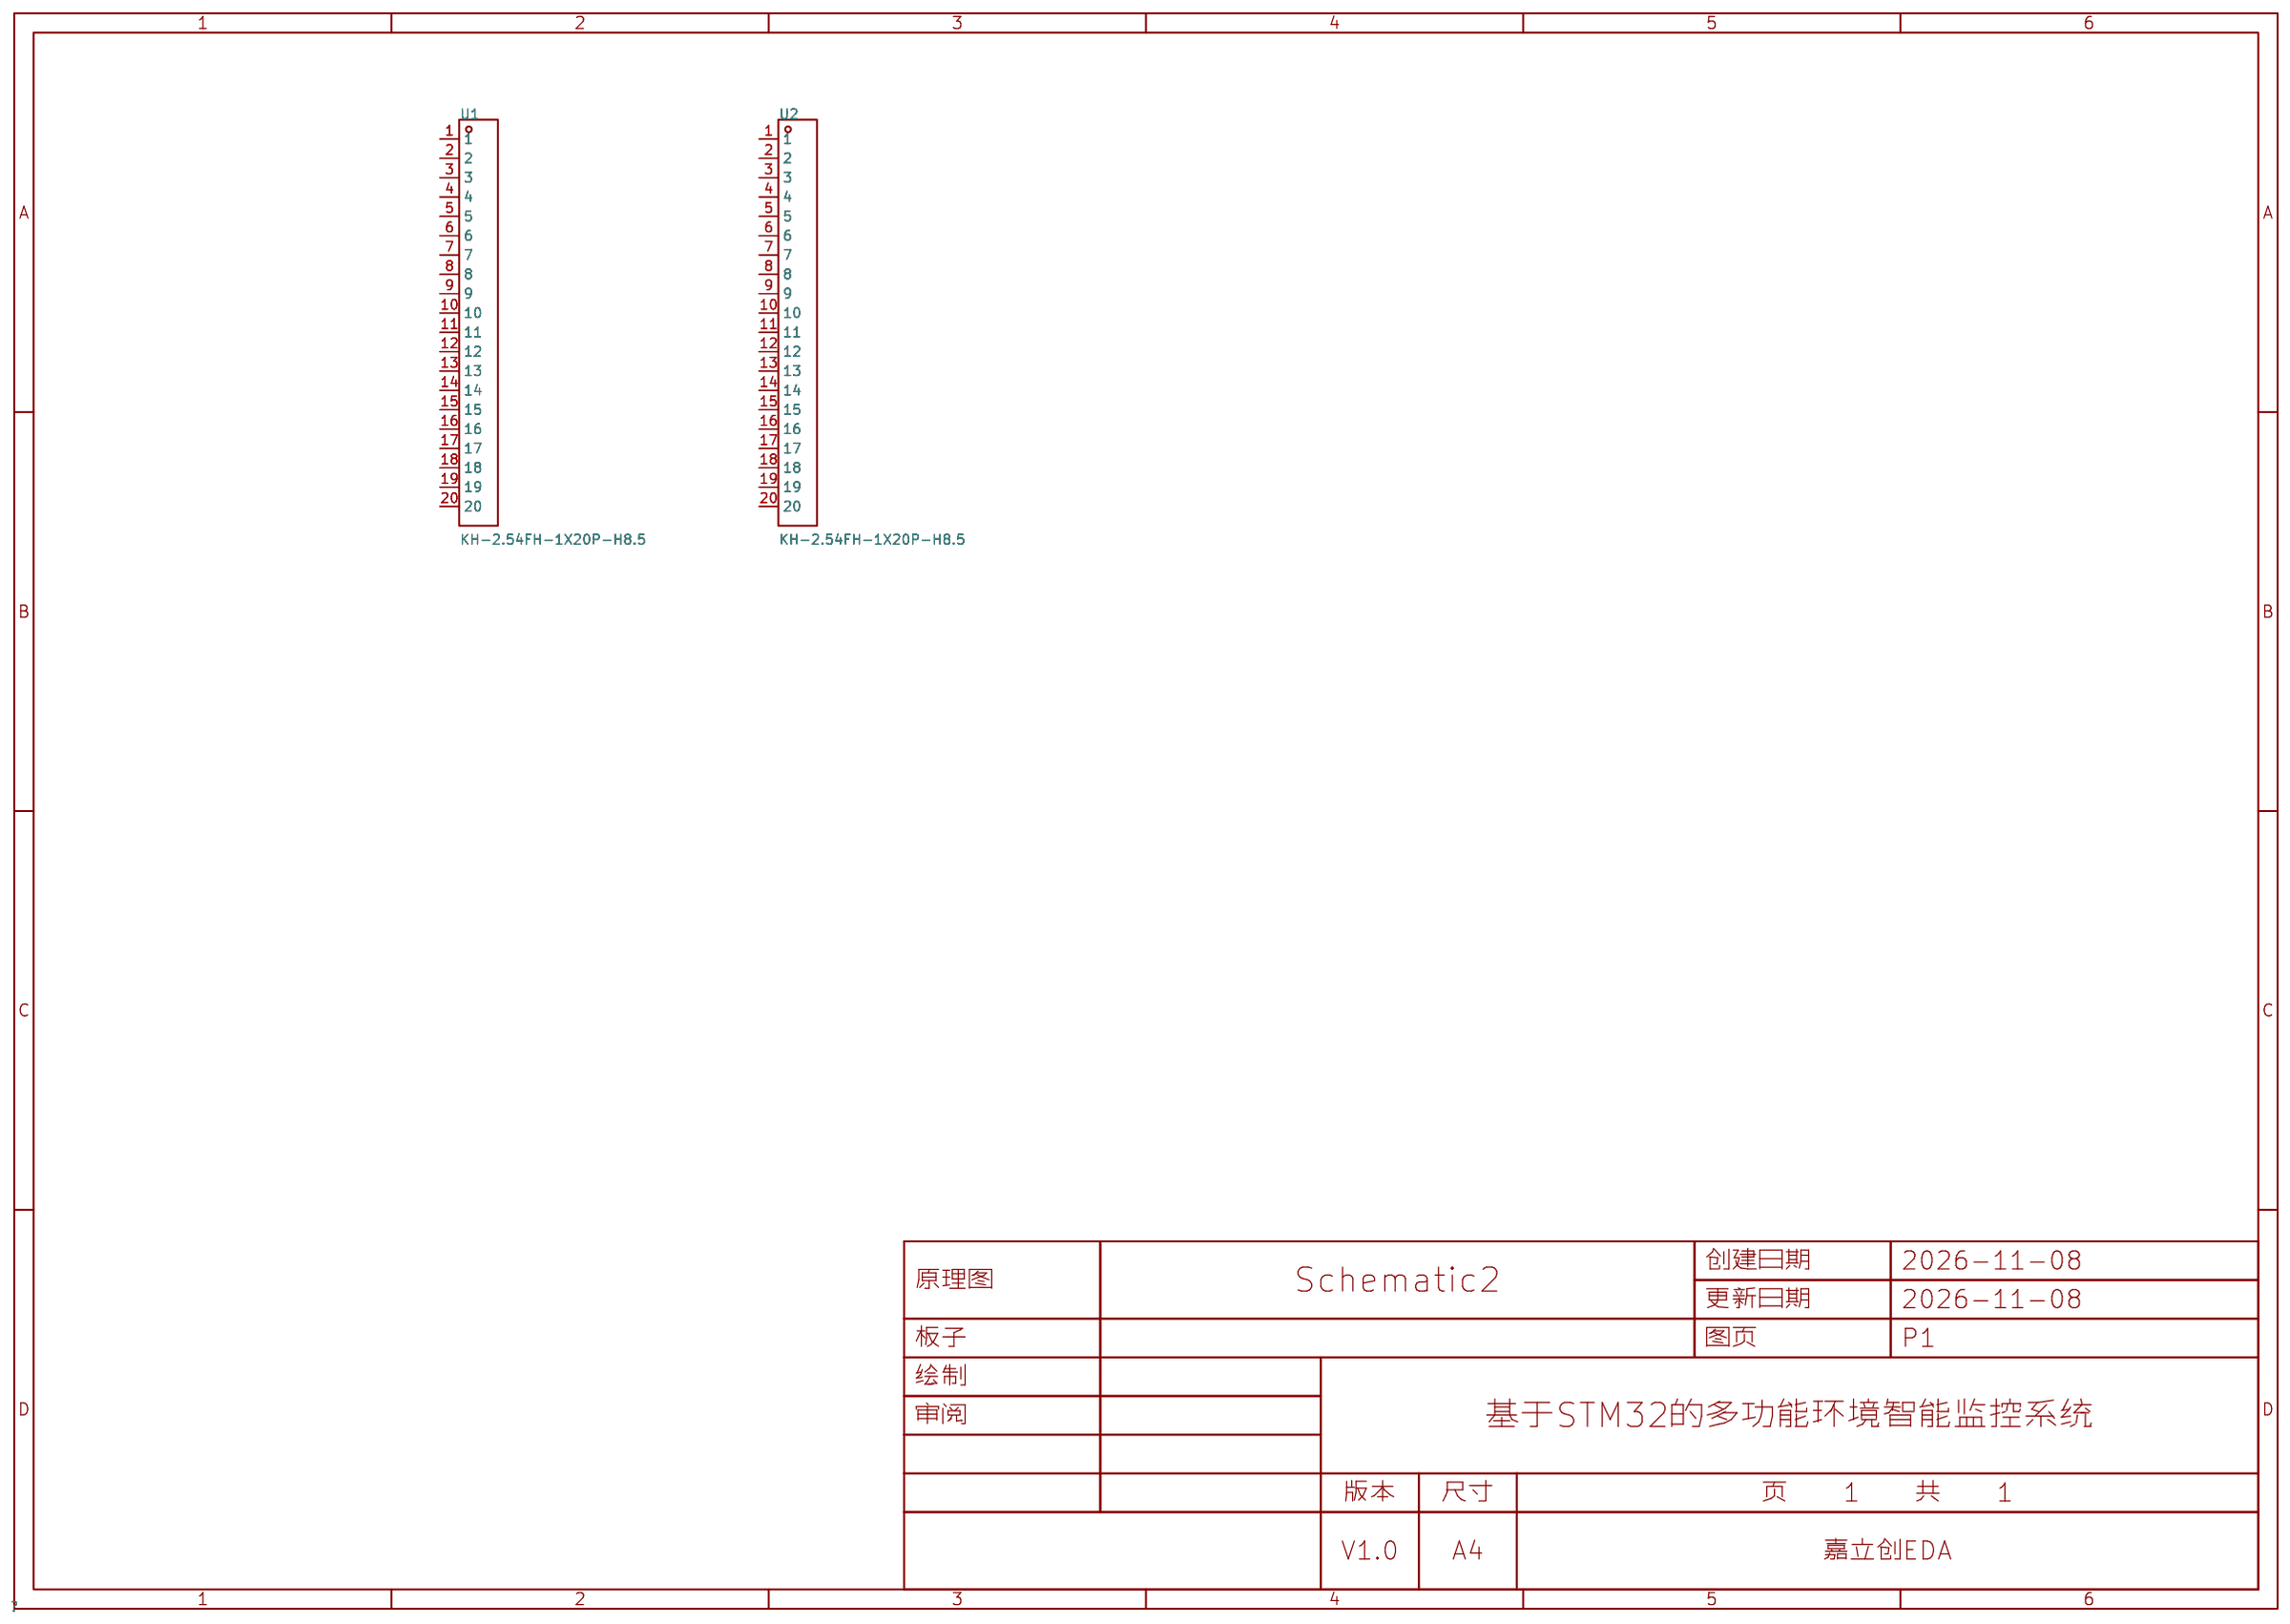
[diagram p2: schematic sheet]

## Parts
U1  KH-2.54FH-1X20P-H8.5  [HDR-TH_20P-P2.54-V-F-2]
U2  KH-2.54FH-1X20P-H8.5  [HDR-TH_20P-P2.54-V-F-2]

## Library data of the parts
U1 U2 = KH-2.54FH-1X20P-H8.5: 插孔结构:1x20P;间距:2.54mm;行距:-;圆孔/方孔:方孔;安装方式:直插;排数:单排;总孔位数:20P;额定电流:3A;额定电压:-;插孔方向:顶部;塑高:8.5mm;触头材质:黄铜;触头镀层:金;工作温度:-40℃~+105℃;; LCSC Part Name: 1x20P 间距:2.54mm 直插; Supplier Part: C2905423; Manufacturer: kinghelm(金航标); Supplier Footprint: 插件,P=2.54mm; JLCPCB Part Class: Extended Part; Datasheet: https://item.szlcsc.com/datasheet/KH-2.54FH-1X20P-H8.5/3175197.html; Supplier: LCSC; Holes Structure: 1x20P; Pitch: 2.54mm; Circular Hole / Square Hole: 方孔; Mounting Type: 直插; Number of Rows: 单排; Number of Positions: 20P; Current Rating: 3A; Holes Direction: 顶部; Insulation Height: 8.5mm; Contact Material: 黄铜; Contact Plating: 金; Operating Temperature: -40℃~+105℃; PIN Length: 3mm

## Nets

Not connected (* = marked no-connect by the designer): U1 1 2 3 4 5 6 7 8 9 10 11 12 13 14 15 16 17 18 19 20; U2 1 2 3 4 5 6 7 8 9 10 11 12 13 14 15 16 17 18 19 20

# Schematic SMD_Draft_Archive

## Sheets
1 P1: Assembly Variant: Basic; Create Date: 2026-11-13; Page Name: P1; Project Name: 基于STM32的多功能环境智能监控系统; Schematic Name: SMD_Draft_Archive; Update Date: 2026-11-13; Company: 嘉立创EDA; Page Size: A4; Version: V1.0
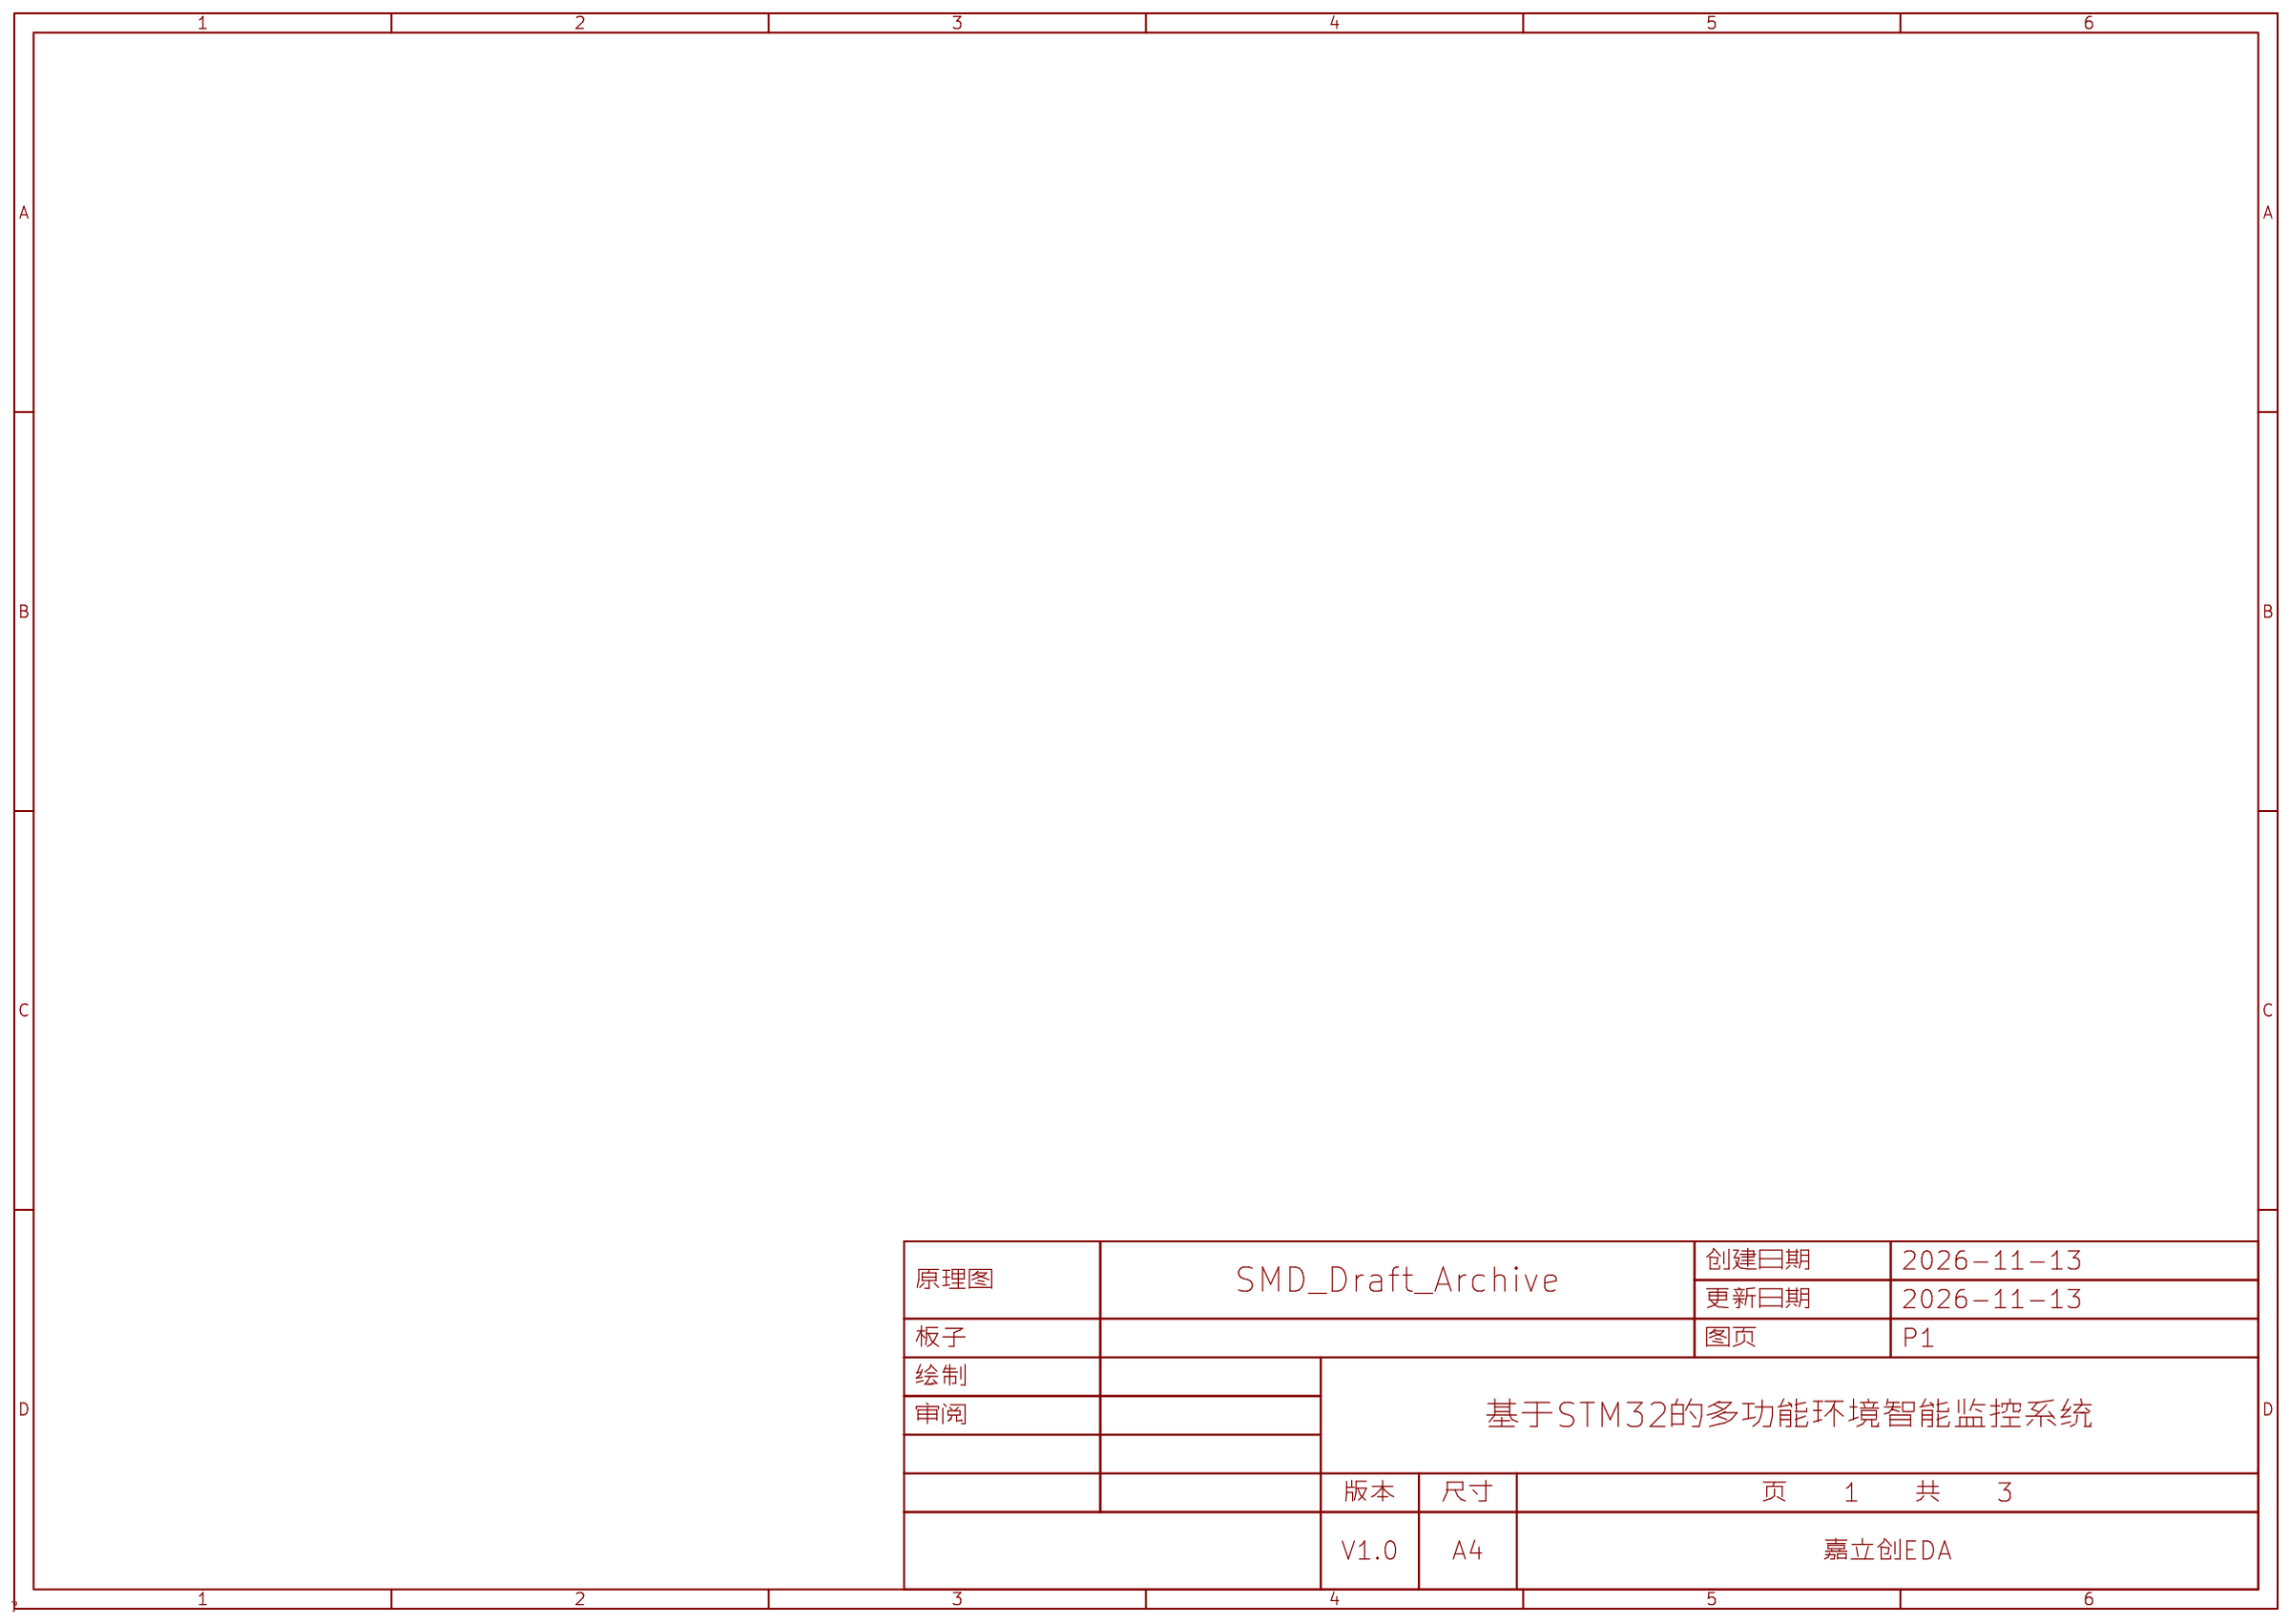
[diagram p3: P1]
2 P2: Page Name: P2
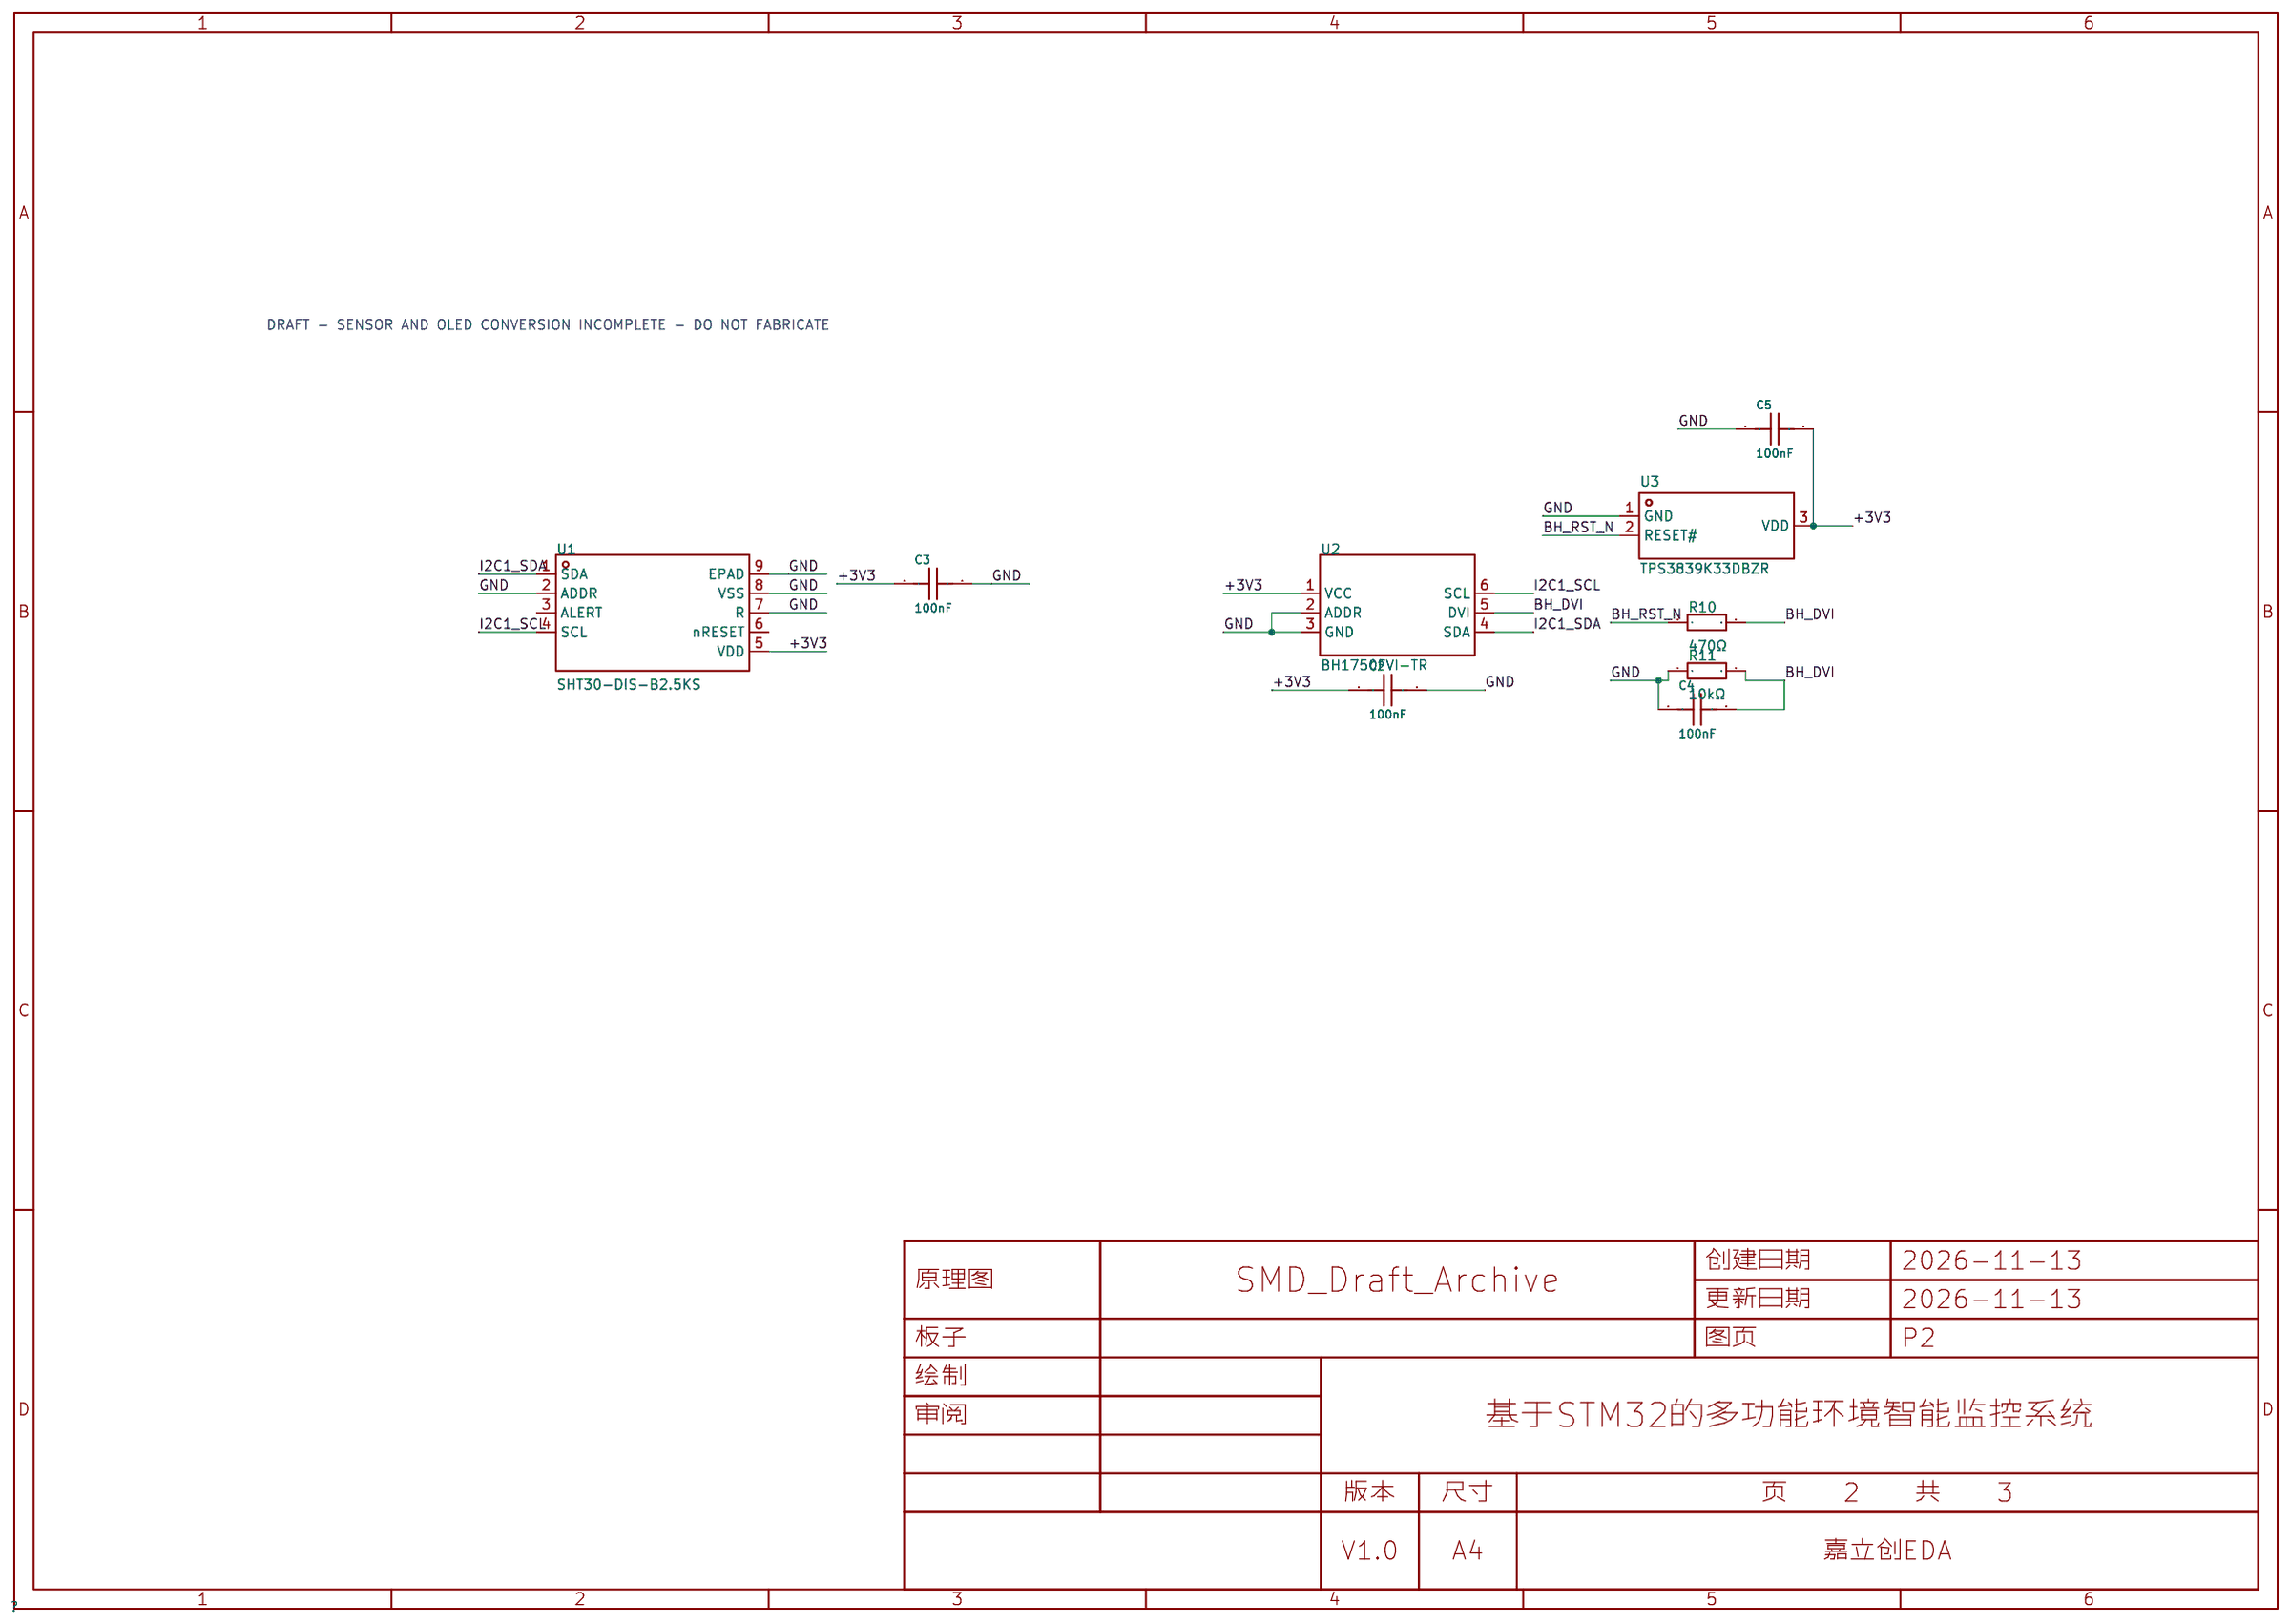
[diagram p4: P2]
3 P3: Page Name: P3
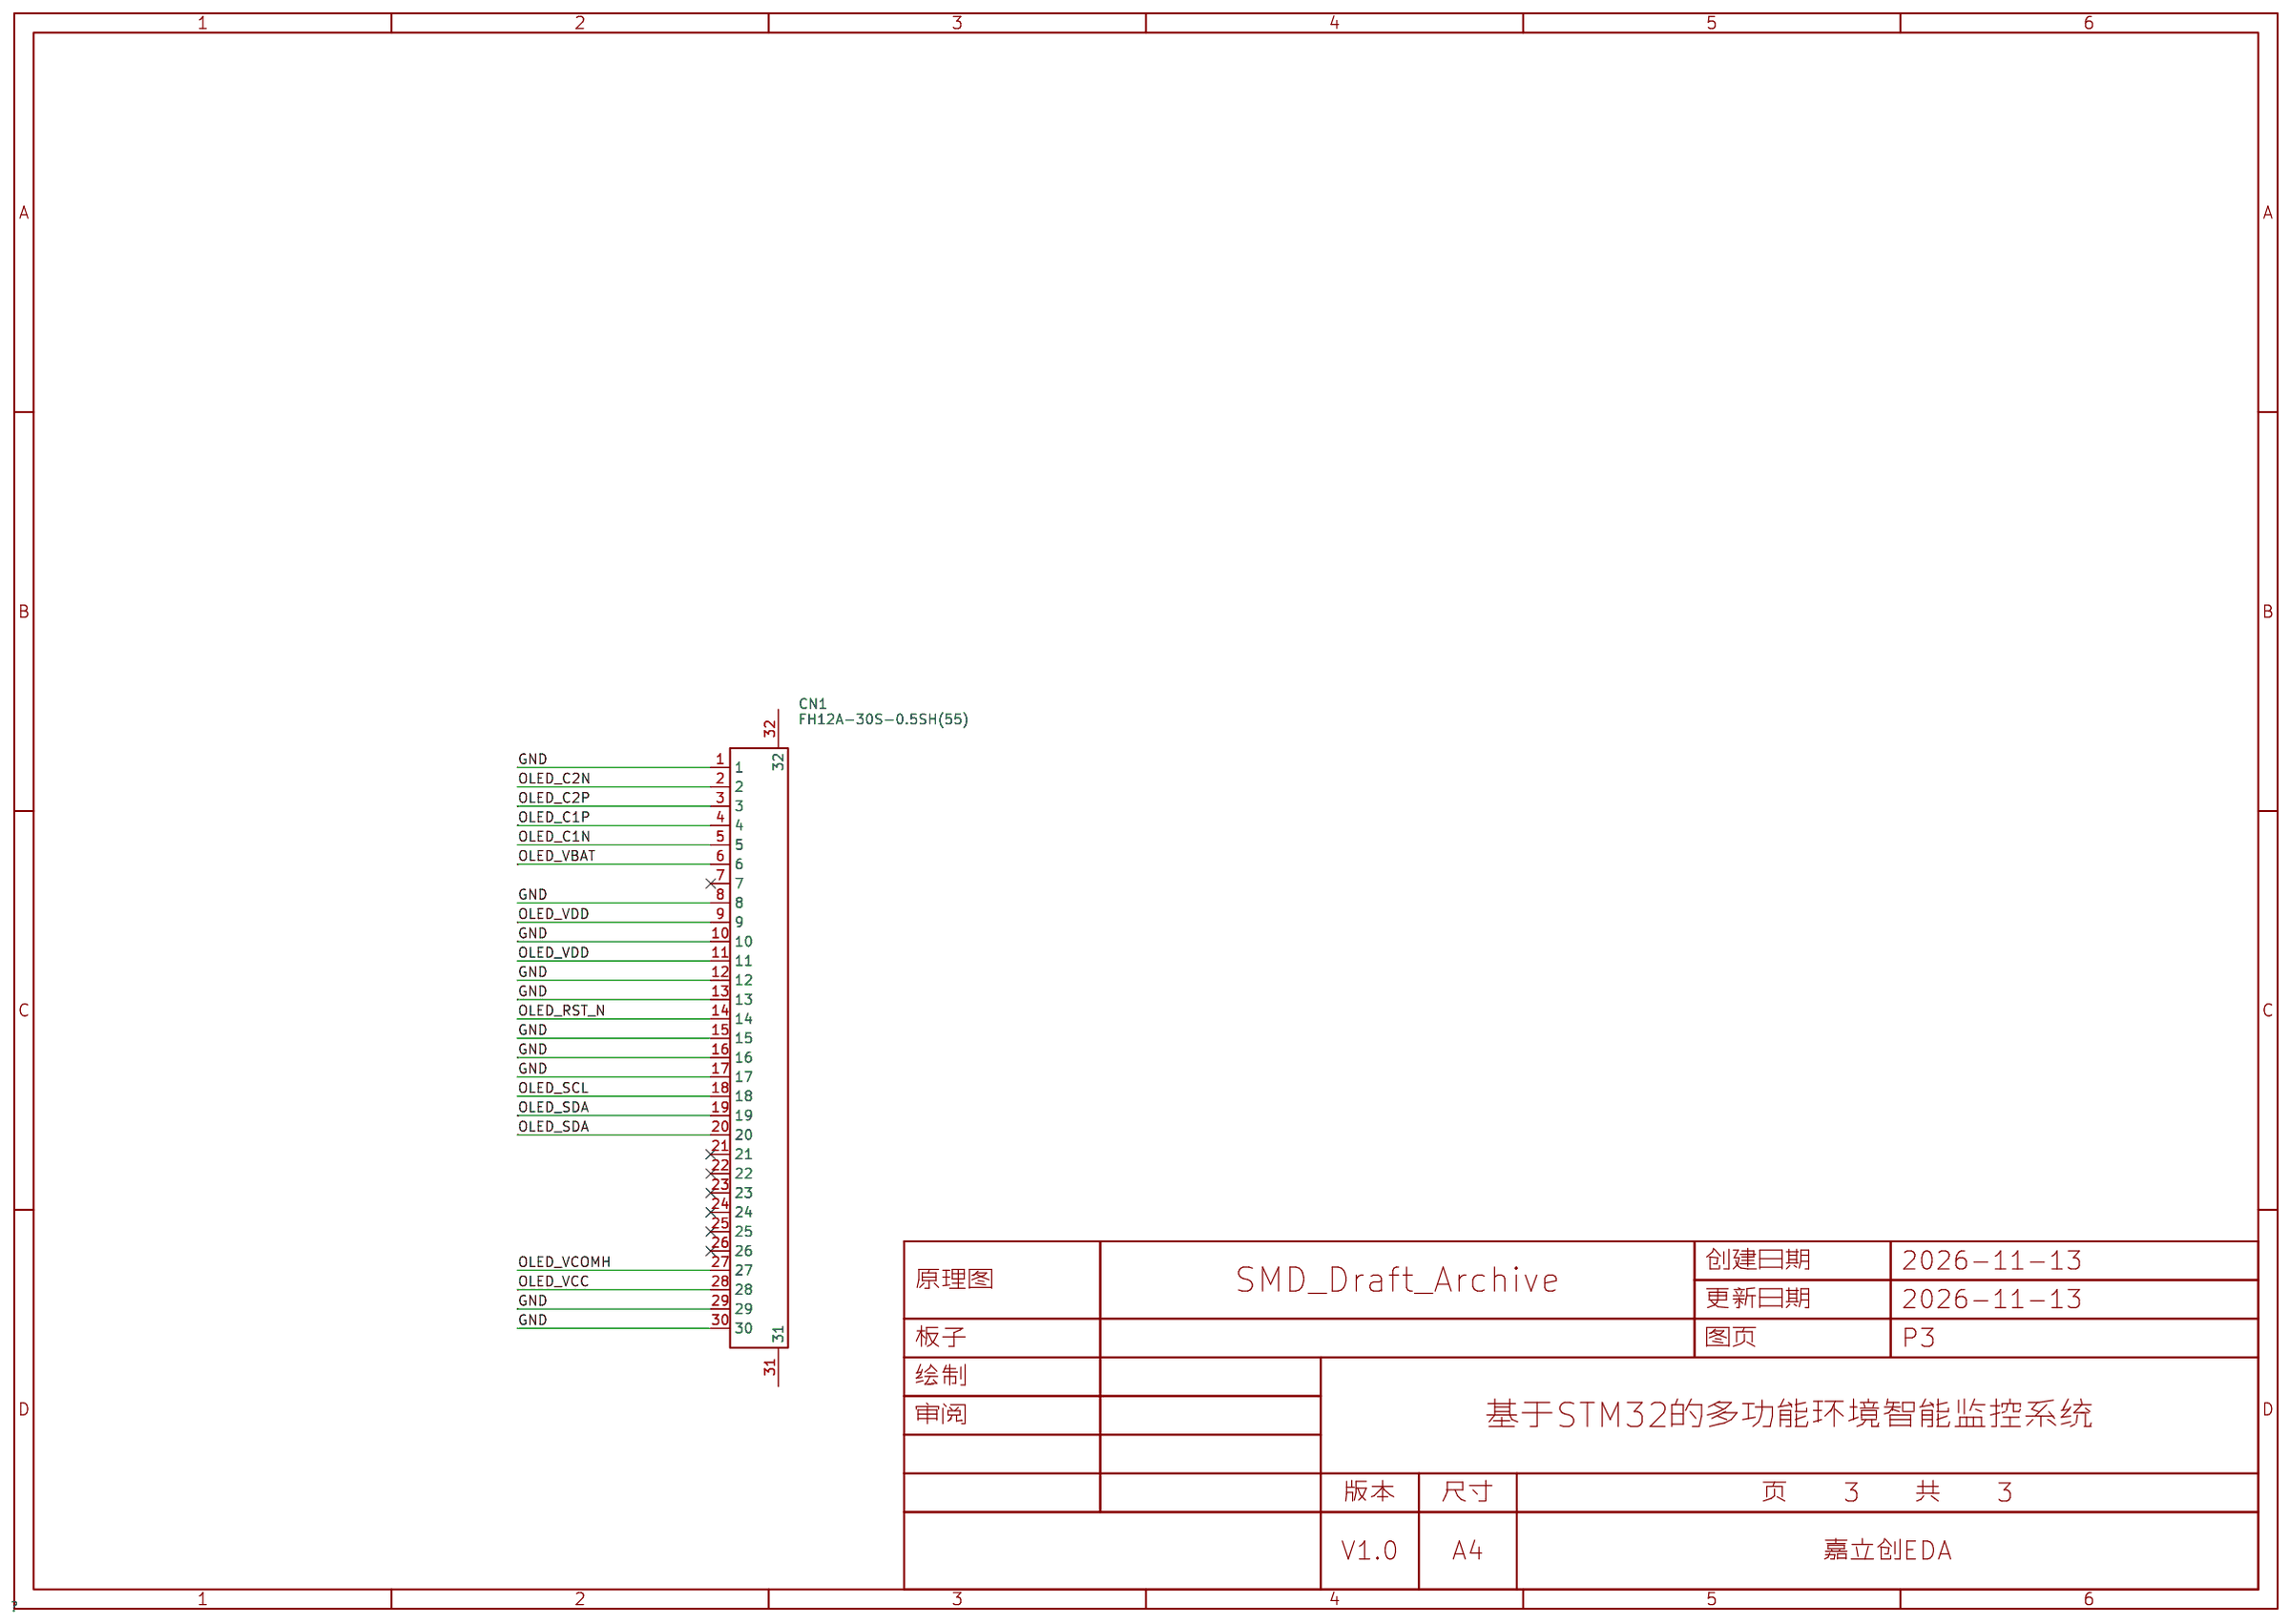
[diagram p5: P3]

## Parts
sheet P2
C2  100nF  [C0603]
C3  100nF  [C0603]
C4  100nF  [C0603]
C5  100nF  [C0603]
R10  470Ω  [R0603]
R11  10kΩ  [R0603]
U1  SHT30-DIS-B2.5KS  [DFN-8_L2.5-W2.5-P0.50-BL-EP]
U2  BH1750FVI-TR  [BH1750_WSOF6I_NO_CENTER_PAD_DRAFT]
U3  TPS3839K33DBZR  [SOT-23-3_L2.9-W1.3-P1.90-LS2.4-BR]
sheet P3
CN1  FH12A-30S-0.5SH(55)  [FPC-SMD_30P-P0.50_FH12A-30S-0.5SH]

## Library data of the parts
C2-C5 = CC0603KRX7R9BB104: 容值:100nF;精度:±10%;额定电压:50V;温度系数:X7R;; LCSC Part Name: 100nF ±10% 50V; Supplier Part: C14663; Manufacturer: YAGEO(国巨); Supplier Footprint: 0603; JLCPCB Part Class: Basic Part; Datasheet: https://item.szlcsc.com/datasheet/CC0603KRX7R9BB104/15331.html; Supplier: LCSC; Tolerance: ±10%; Voltage Rating: 50V; Temperature Coefficient: X7R
R10 = 0603WAF4700T5E: 电阻类型:厚膜电阻;阻值:470Ω;精度:±1%;功率:100mW;工作电压:75V;温度系数:±100ppm/℃;; LCSC Part Name: 厚膜电阻 470Ω ±1%; Supplier Part: C23179; Manufacturer: UNI-ROYAL(厚声); Supplier Footprint: 0603; JLCPCB Part Class: Basic Part; Datasheet: https://item.szlcsc.com/datasheet/0603WAF4700T5E/23906.html; Supplier: LCSC; Type: 厚膜电阻; Tolerance: ±1%; Power(Watts): 100mW; Voltage-Supply(Max): 75V; Temperature Coefficient: ±100ppm/℃; Operating Temperature: -55℃~+155℃
R11 = 0603WAF1002T5E: 电阻类型:厚膜电阻;阻值:10kΩ;精度:±1%;功率:100mW;工作电压:75V;温度系数:±100ppm/℃;; LCSC Part Name: 厚膜电阻 10kΩ ±1% 100mW; Supplier Part: C25804; Manufacturer: UNI-ROYAL(厚声); Supplier Footprint: 0603; JLCPCB Part Class: Basic Part; Datasheet: https://item.szlcsc.com/datasheet/0603WAF1002T5E/26547.html; Supplier: LCSC; Type: 厚膜电阻; Tolerance: ±1%; Power(Watts): 100mW; Voltage-Supply(Max): 75V; Temperature Coefficient: ±100ppm/℃; Operating Temperature: -55℃~+155℃
U1 = SHT30-DIS-B2.5KS: 温度范围:-40℃~+125℃;湿度范围:0%RH~100%RH;接口类型:I2C;湿度精度:±2%RH;; LCSC Part Name: 1-101400-01 1-101400-01 ±2%数字温湿度传感器（10-90%RH）; Supplier Part: C77361; Manufacturer: Sensirion(瑞士盛思锐); Supplier Footprint: DFN-8-EP(2.5x2.5); JLCPCB Part Class: Extended Part; Datasheet: https://item.szlcsc.com/datasheet/SHT30-DIS-B2.5KS/78489.html; Supplier: LCSC; Temperature Range: -40℃~+125℃; Humidity: 0%RH~100%RH; Interface: I2C; Voltage - Supply: 2.15V~5.5V; Current - Supply: 200nA; Humidity Tolerance: ±2%RH; Temperature Tolerance: ±0.2℃; Resolution: 16bit; Features: 温度补偿；工厂校准
U2 = BH1750FVI_TR_6PIN_DRAFT: 检测颜色:-;接口类型:I2C;分辨率:16bit;; LCSC Part Name: 数字16位串行输出环境光传感器IC; Supplier Part: C78960; Manufacturer: ROHM(罗姆); Supplier Footprint: WSOF-6; JLCPCB Part Class: 扩展库; Datasheet: https://item.szlcsc.com/datasheet/BH1750FVI-TR/80097.html; Supplier: LCSC; Measurement Type: 光强; Photoperceptivity: 65.535klx; Interface: I2C; Resolution(Bits): 16bit; Voltage - Supply: 2.4V~3.6V; Quiescent Current: 10nA; Operating Temperature: -40℃~+85℃; Length: 2.6mm; Width: 1.6mm; Height: 0.75mm; Features: 光谱校正/滤光；低功耗/睡眠模式
U3 = TPS3839K33DBZR: 工作电压:900mV~6.5V;复位有效电平:低电平有效;受监控电压数:1;复位超时:200ms;; LCSC Part Name: 150-nA超低功耗电源电压监控器; Supplier Part: C96333; Manufacturer: TI(德州仪器); Supplier Footprint: SOT-23; JLCPCB Part Class: Extended Part; Datasheet: https://www.ti.com/cn/lit/ds/symlink/tps3839.pdf; Supplier: LCSC; ChipType: 电压监控器; Output Type: 推挽; Voltage - Supply: 900mV~6.5V; Reset Active Level: 低电平有效; Threshold Voltage: 2.93V; Number of Voltages Monitored: 1; Reset Timeout: 200ms; Operating Temperature: -40℃~+85℃; Quiescent Current: 150nA
CN1 = FH12A-30S-0.5SH(55): 锁定特性:翻盖式;触点类型:上接;触点数量:30P;间距:0.5mm;安装方式:卧贴;工作温度:-40℃~+85℃;; LCSC Part Name: 间距:0.5mm P数:30P 翻盖式 上接; Supplier Part: C3036214; Manufacturer: HRS(广濑); Supplier Footprint: SMD,P=0.5mm,卧贴; JLCPCB Part Class: Extended Part; Datasheet: https://item.szlcsc.com/datasheet/FH12A-30S-0.5SH(55)/3586811.html; Supplier: LCSC; Locking Feature: 翻盖式; Contact Type: 上接; Number of Contacts: 30P; Pitch: 0.5mm; Mounting Type: 卧贴; FFC, FCB Thickness: 0.3mm; Height Above Board: 2mm; Contact Material: 磷青铜; Contact Plating: 金; Operating Temperature: -40℃~+85℃

## Nets
+3V3: C2.1 C3.1 C5.2 U1.5(VDD) U2.1(VCC) U3.3(VDD)
GND: C2.2 C3.2 C4.1 C5.1 CN1.1 CN1.8 CN1.10 CN1.12 CN1.13 CN1.15 CN1.16 CN1.17 CN1.29 CN1.30 R11.1 U1.2(ADDR) U1.7(R) U1.8(VSS) U1.9(EPAD) U2.2(ADDR) U2.3(GND) U3.1(GND)
BH_DVI: C4.2 R10.2 R11.2 U2.5(DVI)
BH_RST_N: R10.1 U3.2(RESET#)
I2C1_SCL: U1.4(SCL) U2.6(SCL)
I2C1_SDA: U1.1(SDA) U2.4(SDA)
OLED_C1N: CN1.5
OLED_C1P: CN1.4
OLED_C2N: CN1.2
OLED_C2P: CN1.3
OLED_RST_N: CN1.14
OLED_SCL: CN1.18
OLED_SDA: CN1.19 CN1.20
OLED_VBAT: CN1.6
OLED_VCC: CN1.28
OLED_VCOMH: CN1.27
OLED_VDD: CN1.9 CN1.11

Not connected (* = marked no-connect by the designer): CN1 7* 21* 22* 23* 24* 25* 26* 31 32; U1 3(ALERT) 6(nRESET)

## Notes on the sheets
sheet 2
- DRAFT - SENSOR AND OLED CONVERSION INCOMPLETE - DO NOT FABRICATE

# Board PCB1
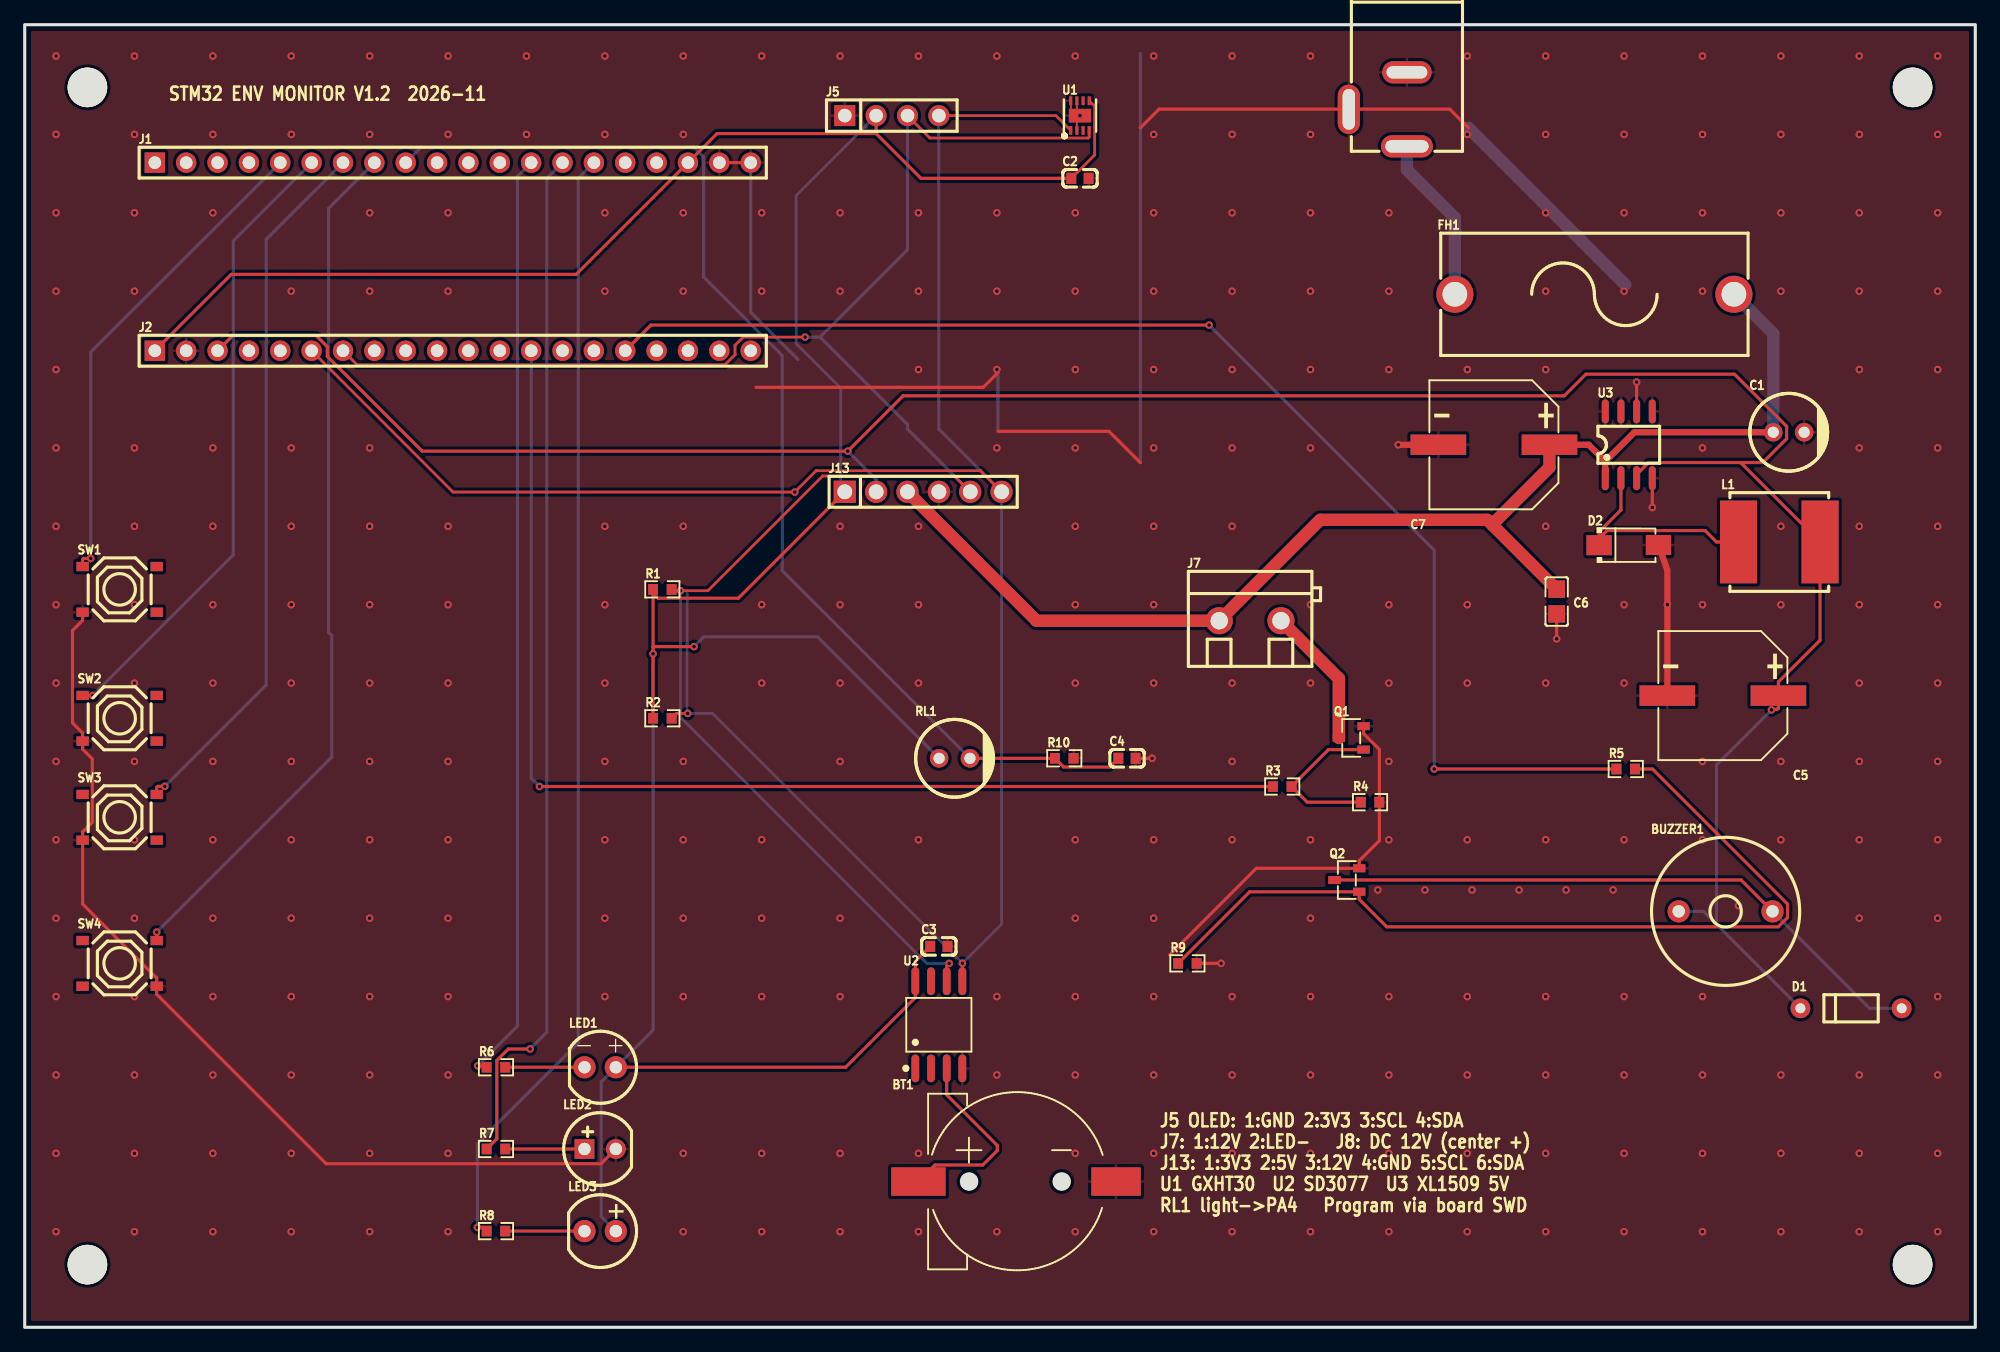
[diagram p6: board, top side]
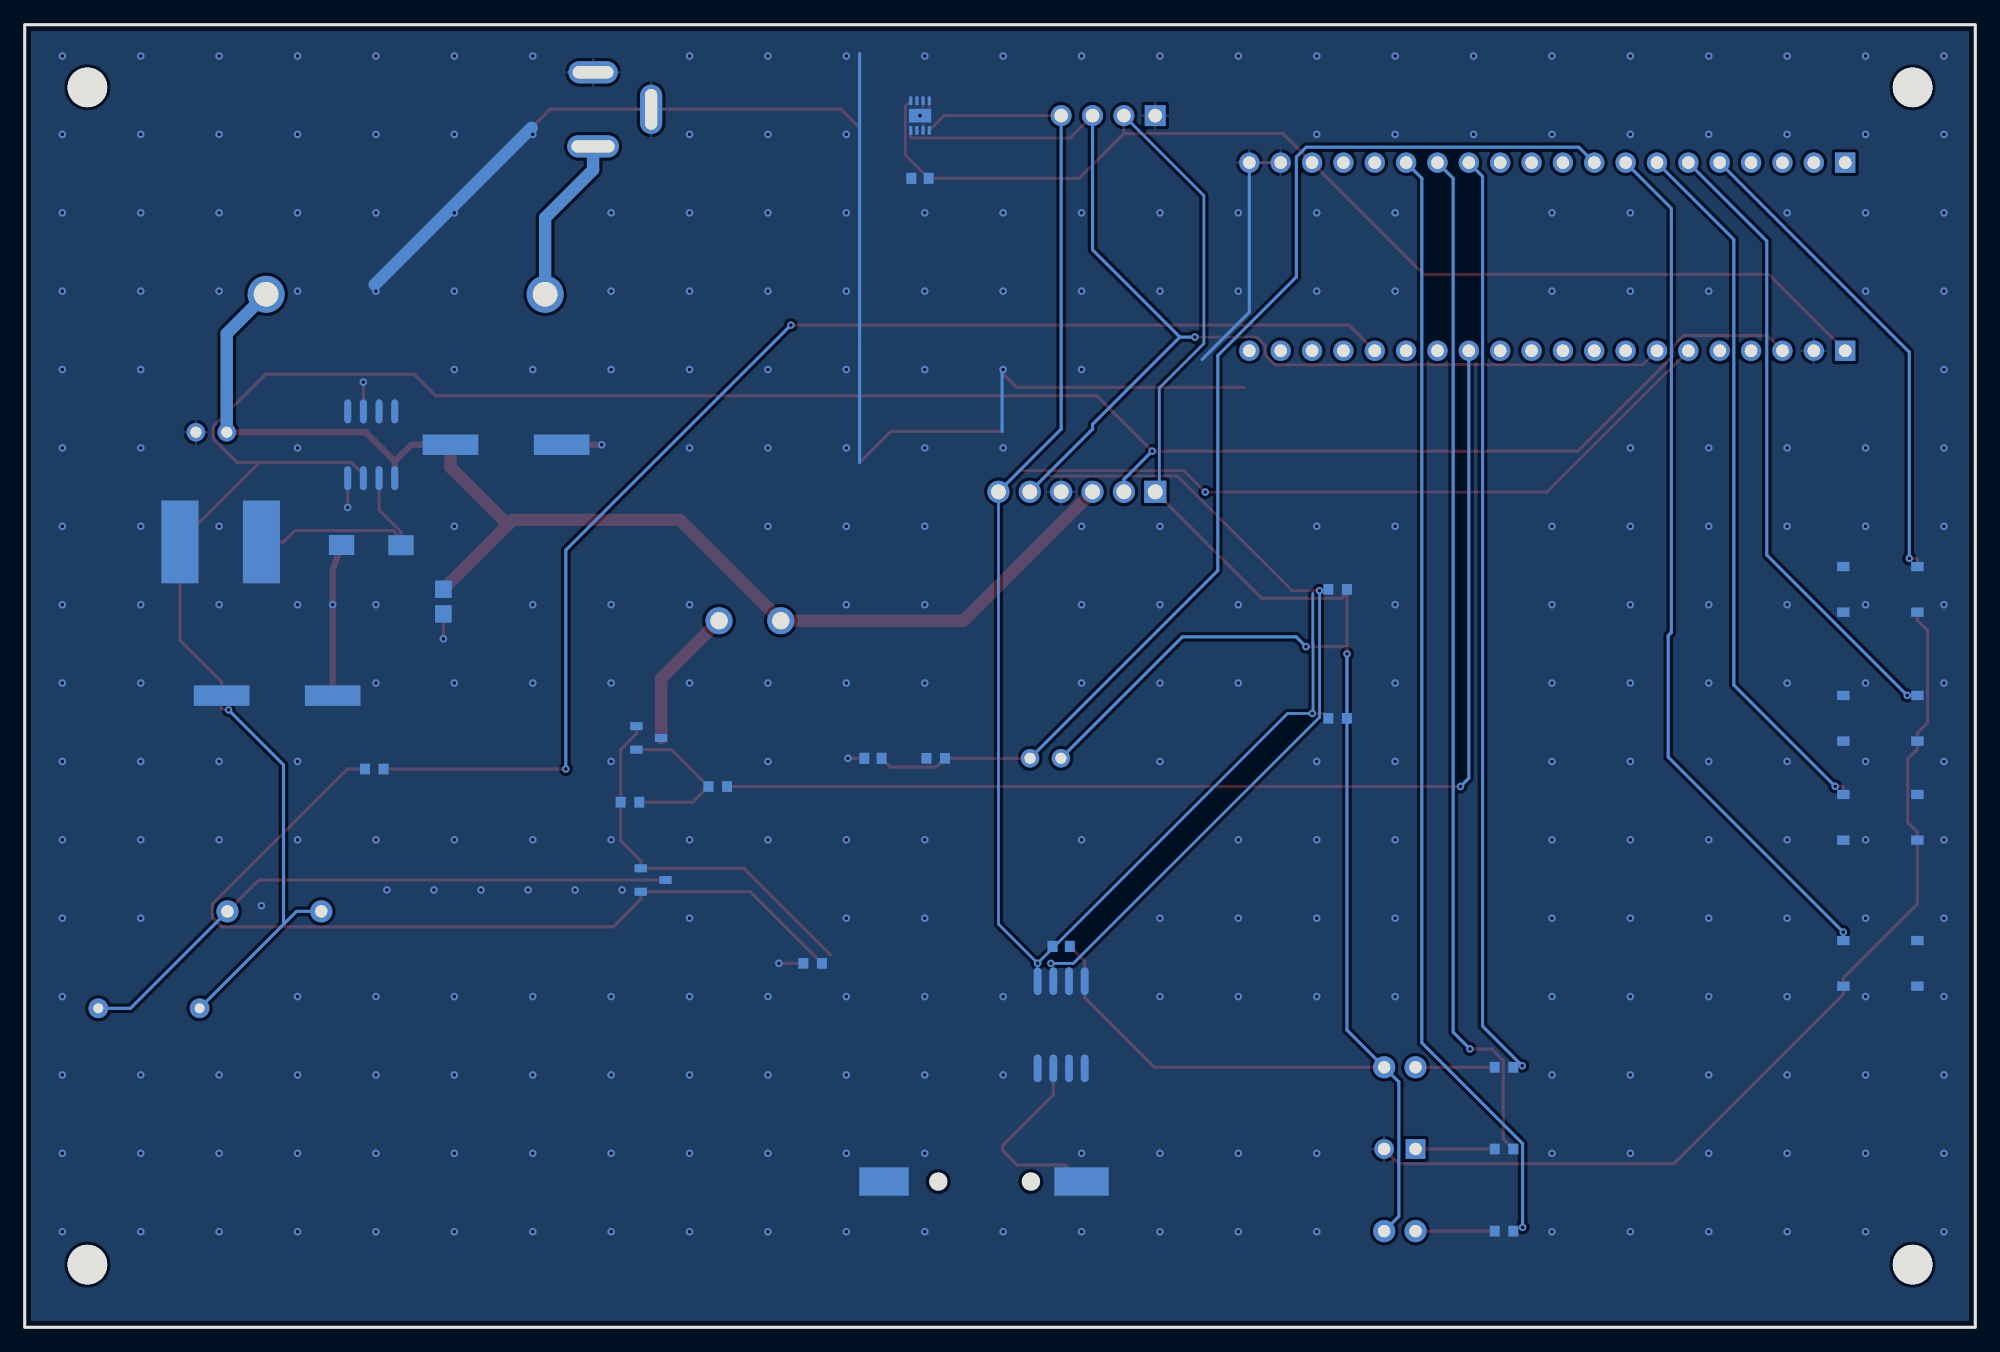
[diagram p7: board, bottom side, seen from below]

Outline 157.99 x 105.54 mm; copper layers: Top Layer, Bottom Layer. Coordinates in mm from the lower left corner of the outline.
Outline path: rectangle 0,105.54 157.99,0
Stack: Top Layer 0.035mm / Dielectric1 1.51mm FR4 er 4.5 / Bottom Layer 0.035mm

## Design rules (mm)
spacing copperThickness1oz (default): track to track 0.102, other pairs 0.152 to 0.3
spacing copperThickness2oz: track to track 0.203, other pairs 0.152 to 0.3
track width copperThickness1oz (default): min 0.127, default 0.254, max 2.54
track width copperThickness2oz: min 0.203, default 0.254, max 2.54
track width POWER_1A: min 0.127, default 1, max 2.54
differential pair differentialPair (default): width min 0.127, default 0.254, max 2.54; gap min 0.152, default 0.152
net +12V uses POWER_1A
net LAMP_NEG uses POWER_1A
net VIN_12V uses POWER_1A

## Placement (name value [footprint] x y rotation side)
BT1  KH-CR1220-2  [BAT-SMD_CR1220-2]  80.39 11.81 0 top
BUZZER1  2.4kHz  [BUZ-TH_BD12.0-P7.60-D0.6-FD]  137.76 33.7 0 top
C1  100uF  [CAP-TH_BD6.3-P2.50-D0.5-FD]  142.88 72.52 0 top
C2  100nF  [C0603]  85.47 93.09 0 top
C3  100nF  [C0603]  74.04 30.86 0 top
C4  100nF  [C0603]  89.28 46.1 0 top
C5  470uF  [CAP-SMD_BD10.0-L10.3-W10.3-LS11.3-FD]  137.54 51.18 180 top
C6  1uF  [C0805]  124.08 58.8 270 top
C7  470uF  [CAP-SMD_BD10.0-L10.3-W10.3-LS11.3-FD]  119 71.5 180 top
D1  1N4148TR  [DO-35_BD2.0-L4.2-P8.20-D0.5-RD]  147.92 25.85 0 top
D2  SS34  [SMA_L4.3-W2.6-LS5.0-RD]  129.92 63.37 0 top
FH1  FH1-200CK-G  [FUSE-TH_L24.8-W9.8-P22.60]  127.14 83.69 0 top
J1  KH-2.54FH-1X20P-H8.5  [HDR-TH_20P-P2.54-V-F-2]  34.67 94.36 0 top
J2  KH-2.54FH-1X20P-H8.5  [HDR-TH_20P-P2.54-V-F-2]  34.67 79.12 0 top
J5  2.54-1*4P母  [HDR-TH_4P-P2.54-V-F]  70.23 98.17 0 top
J7  KF301-5.0-2P  [CONN-TH_P5.00_KF301-5.0-2P]  99.25 57.25 0 top
J8  DC-005-5A-2.0  [DC-IN-TH_DC-005-5A-2.0]  109.6 98.68 270 top
J13  2.54-1x6P直针  [HDR-TH_6P-P2.54-V-M-1]  72.77 67.69 0 top
L1  68uH  [IND-SMD_L8.0-W8.0_SMNR8040]  142.11 63.63 0 top
LED1  XL-502SURD  [LED-TH_BD5.9-P2.54-RD_RED]  46.61 21.07 0 top
LED2  XL-502SYGD  [LED-TH_BD5.8-P2.54-RD]  46.61 14.45 0 top
LED3  XL-502UYD  [LED-TH_BD5.9-P2.54-RD_YELLOW]  46.61 7.79 0 top
NOREF  -  [Pad_e224]  152.91 100.46 0 top
NOREF#2  -  [Pad_e226]  152.91 5.08 0 top
NOREF#3  -  [Pad_e223]  5.08 100.46 0 top
NOREF#4  -  [Pad_e225]  5.08 5.08 0 top
Q1  AO3400A  [SOT-23-3_L2.9-W1.3-P1.90-LS2.4-BR]  107.44 47.75 0 top
Q2  S8050(0.5A)  [SOT-23-3_L2.9-W1.3-P1.90-LS2.4-BR]  107.09 36.24 0 top
R1  4.7kΩ  [R0603]  51.65 59.79 0 top
R2  4.7kΩ  [R0603]  51.65 49.34 0 top
R3  100Ω  [R0603]  101.85 43.81 0 top
R4  10kΩ  [R0603]  108.97 42.55 0 top
R5  1kΩ  [R0603]  129.68 45.23 0 top
R6  330Ω  [R0603]  38.17 21.07 0 top
R7  330Ω  [R0603]  38.17 14.45 0 top
R8  330Ω  [R0603]  38.17 7.79 0 top
R9  100kΩ  [R0603]  94.17 29.49 0 top
R10  10kΩ  [R0603]  84.2 46.1 0 top
RL1  GL4539（30-40K）  [CAP-TH_BD6.3-P2.50-D0.5-FD]  75.31 46.1 0 top
SW1  TS-1187A-B-A-B  [SW-SMD_4P-L5.1-W5.1-P3.70-LS6.5-TL_H1.5]  7.69 59.79 0 top
SW2  TS-1187A-B-A-B  [SW-SMD_4P-L5.1-W5.1-P3.70-LS6.5-TL_H1.5]  7.69 49.34 0 top
SW3  TS-1187A-B-A-B  [SW-SMD_4P-L5.1-W5.1-P3.70-LS6.5-TL_H1.5]  7.69 41.32 0 top
SW4  TS-1187A-B-A-B  [SW-SMD_4P-L5.1-W5.1-P3.70-LS6.5-TL_H1.5]  7.69 29.49 0 top
U1  GXHT30C  [DFN-8_L2.5-W2.5-P0.50-BL-EP]  85.47 98.17 0 top
U2  SD3077  [SOIC-8_L5.3-W5.3-P1.27-LS8.0-BL]  74.04 24.51 0 top
U3  XL1509-5.0E1  [SOIC-8_L5.0-W4.0-P1.27-LS6.0-BL]  129.92 71.5 0 top

## Footprints (pads in the part's own frame, mm; a bottom-side part is the same pattern mirrored in y, then rotated)
BAT-SMD_CR1220-2
  rect 4.4x2.3 hole 0.001: 1(-8,0)
  rect 4x2.3 hole 0.001: 2(8,0)
BUZ-TH_BD12.0-P7.60-D0.6-FD
  round 1.8 hole 1: 1(-3.8,0) 2(3.8,0)
C0603
  rect 0.8x0.9 hole 0.001: 1(-0.7,0) 2(0.7,0)
C0805
  rect 1.41x1.35 hole 0.001: 1(-1,0) 2(1,0)
CAP-SMD_BD10.0-L10.3-W10.3-LS11.3-FD
  rect 4.5x1.65 hole 0.001: 1(-4.5,0) 2(4.5,0)
CAP-TH_BD6.3-P2.50-D0.5-FD
  round 1.5 hole 0.9: 1(-1.25,0) 2(1.25,0)
CONN-TH_P5.00_KF301-5.0-2P
  round 2.2 hole 1.4: 1(-2.5,0) 2(2.5,0)
DC-IN-TH_DC-005-5A-2.0
  oval 1.8x4.2 hole 1x3.5: 1(3,2.352)
  oval 1.8x4 hole 1x3.3: 2(-3,2.352)
  oval 4x1.8 hole 3.3x1: 3(-0.001,-2.352)
DFN-8_L2.5-W2.5-P0.50-BL-EP
  rect 0.25x0.7 hole 0.001: 1(-0.75,-1.2) 2(-0.25,-1.2) 3(0.25,-1.2) 4(0.75,-1.2) 5(0.75,1.2) 6(0.25,1.2) 7(-0.25,1.2) 8(-0.75,1.2)
  rect 1.8x1.1 hole 0.001: 9(0,0)
DO-35_BD2.0-L4.2-P8.20-D0.5-RD
  round 1.6 hole 0.8: 1(-4.1,0) 2(4.1,0)
FUSE-TH_L24.8-W9.8-P22.60
  round 3 hole 2: 1(-11.3,0) 2(11.3,0)
HDR-TH_4P-P2.54-V-F
  rect 1.7x1.7 hole 1.1: 1(-3.81,0)
  round 1.7 hole 1.1: 2(-1.27,0) 3(1.27,0) 4(3.81,0)
HDR-TH_6P-P2.54-V-M-1
  rect 1.8x1.8 hole 1.2: 1(-6.35,0)
  round 1.8 hole 1.2: 2(-3.81,0) 3(-1.27,0) 4(1.27,0) 5(3.81,0) 6(6.35,0)
HDR-TH_20P-P2.54-V-F-2
  rect 1.65x1.65 hole 1.02: 1(-24.13,0)
  round 1.65 hole 1.02: 2(-21.59,0) 3(-19.05,0) 4(-16.51,0) 5(-13.97,0) 6(-11.43,0) 7(-8.89,0) 8(-6.35,0) 9(-3.81,0) 10(-1.27,0) 11(1.27,0) 12(3.81,0) 13(6.35,0) 14(8.89,0) 15(11.43,0) 16(13.97,0) 17(16.51,0) 18(19.05,0) 19(21.59,0) 20(24.13,0)
IND-SMD_L8.0-W8.0_SMNR8040
  rect 3x6.7 hole 0.001: 1(-3.3,0) 2(3.3,0)
LED-TH_BD5.8-P2.54-RD
  round 1.6 hole 1: 1(1.27,0)
  rect 1.6x1.6 hole 1: 2(-1.27,0)
LED-TH_BD5.9-P2.54-RD_RED
  round 1.8 hole 1: 1(-1.27,0) 2(1.27,0)
LED-TH_BD5.9-P2.54-RD_YELLOW
  round 1.8 hole 1: 1(-1.27,0) 2(1.27,0)
Pad_e223
  round 3.2 hole 3.2: 1(0,0)
Pad_e224
  round 3.2 hole 3.2: 1(0,0)
Pad_e225
  round 3.2 hole 3.2: 1(0,0)
Pad_e226
  round 3.2 hole 3.2: 2(0,0)
R0603
  rect 0.806x0.864 hole 0.001: 1(-0.753,0) 2(0.753,0)
SMA_L4.3-W2.6-LS5.0-RD
  rect 2.046x1.62 hole 0.001: 1(-2.404,-0.009) 2(2.404,0.009)
SOIC-8_L5.0-W4.0-P1.27-LS6.0-BL
  oval 0.569x1.95 hole 0.001: 1(-1.905,-2.705) 2(-0.635,-2.705) 3(0.635,-2.705) 4(1.905,-2.705) 5(1.905,2.705) 6(0.635,2.705) 7(-0.635,2.705) 8(-1.905,2.705)
SOIC-8_L5.3-W5.3-P1.27-LS8.0-BL
  oval 0.63x2.25 hole 0.001: 1(-1.905,-3.53) 2(-0.635,-3.53) 3(0.635,-3.53) 4(1.905,-3.53) 5(1.905,3.53) 6(0.635,3.53) 7(-0.635,3.53) 8(-1.905,3.53)
SOT-23-3_L2.9-W1.3-P1.90-LS2.4-BR
  rect 1x0.65 hole 0.001: 1(1,-0.95) 2(1,0.95) 3(-1,0)
SW-SMD_4P-L5.1-W5.1-P3.70-LS6.5-TL_H1.5
  rect 1x0.75 hole 0.001: 1(-3,1.85) 2(3,1.85) 3(-3,-1.85) 4(3,-1.85)

## Nets
As in the schematic.

Pads without a net: J1 1 2 3 4 10 11 12 16 17; J2 4 5 8 9 10 11 12 14 15 17 18 19 20; NOREF 1; NOREF#2 2; NOREF#3 1; NOREF#4 1; SW1 2 4; SW2 2 4; SW3 1 4; SW4 1 3; U1 3 6; U2 1 2 7

## Via types
v1: diameter 0.61, hole 0.305, Top Layer to Bottom Layer, 341 vias

## Routing (per net, layer and track width the routed paths; a pad name or vN(x,y) marks a point on that pad's centre or on a via; arc(x,y) is an arc through that point)
+3V3: length 264
  Top Layer w0.224: U1.5 86.66,98.93 86.66,94.98 C2.1
  Top Layer w0.254: R2.1 v1(50.89,54.56) 50.89,55.15 ; C3.1 72.14,29.66 U2.8 72.14,26.71 66.49,21.07 LED1.2 ; J13.1 57.8,59.07 51.31,59.07 50.89,59.48 ; J2.1 16.73,85.31 44.67,85.31 J1.18 56.08,96.72 68.96,96.72 ; 68.96,96.72 72.59,93.09 C2.1 ; 68.96,96.72 J5.2 ; 50.89,55.15 R1.1 ; 50.89,55.15 v1(54.21,55.15)
  Bottom Layer w0.224: J5.2 62.48,91.69 62.48,79.71 66.09,76.09 66.09,68.02 J13.1
  Bottom Layer w0.254: v1(50.89,54.56) 50.89,24.08 LED1.2 46.69,19.88 46.69,8.98 LED3.2 ; RL1.1 64.22,55.94 55,55.94 v1(54.21,55.15)
+5V: length 212.1
  Top Layer w0.254: 138.98,70.06 L1.2 145.41,55.66 142.04,52.29 C5.1 142.04,50.16 141.95,50.07 141.48,50.07 v1(141.48,50.02) ; 138.98,70.06 140.78,70.06 142.71,71.99 142.71,73 138.49,77.22 126.45,77.22 124.7,75.47 71.15,75.47 v1(66.67,70.99) 32.19,70.99 24.51,78.67 24.51,79.44 23.6,80.35 16.85,80.35 J2.3 ; 138.98,70.06 131.53,70.06 130.56,69.09 U3.3
  Bottom Layer w0.254: J13.2 68.96,68.69 v1(66.67,70.99) ; D1.1 135.97,33.7 133.96,33.7 ; 137.02,32.65 137.02,45.57 v1(141.48,50.02)
+12V: length 104.5
  Top Layer w0.511: C1.1 130.37,72.52 128.02,70.16 ; 128.02,70.16 126.68,71.5 C7.1 ; 128.02,70.16 U3.1
  Top Layer w1: C7.1 123.5,69.68 118.85,65.03 ; C6.1 118.85,65.03 ; 118.85,65.03 118.46,65.42 104.93,65.42 J7.1 81.95,57.25 J13.3
  Bottom Layer w1: FH1.2 141.62,80.51 C1.1
GND: length 274.8
  Top Layer w0.152: 84.73,99.37 84.73,98.17 ; 85.22,96.98 85.22,99.37
  Top Layer w0.254: 89.99,46.1 v1(91.31,46.1) ; J1.19 J1.20 ; 90.36,70.05 87.82,72.59 78.83,72.59 ; 59.23,76.16 77.64,76.16 78.83,77.34 ; LED2.1 46.68,13.25 24.42,13.25 10.69,26.98 SW4.4 10.69,28.29 4.69,34.3 SW3.3 4.69,40.13 5.47,40.91 5.47,46.05 4.69,46.83 SW2.3 4.69,48.15 3.87,48.97 3.87,56.46 4.69,57.28 SW1.3 ; Q1.2 108.44,48.09 109.72,46.82 R4.2 109.72,39.43 108.09,37.8 Q2.2 99.75,37.19 92.73,30.17 ; 131.83,68.81 v1(131.83,66.42) ; 116.94,97.18 115.42,98.7 91.88,98.7 90.36,97.18 ; 124.08,57.81 v1(124.08,55.78) ; 94.92,29.49 v1(96.9,29.49) ; 130.56,74.22 v1(130.56,76.58)
  Top Layer w0.508: 133.05,51.18 133.05,61.34 132.33,63.37 ; 114.5,71.5 v1(111.25,71.5)
  Bottom Layer w0.254: 78.83,72.59 78.83,77.34 ; 90.36,70.05 90.36,103.2 ; J1.20 58.8,82.24 62.62,78.42
  Bottom Layer w1.016: 129.64,84.48 116.94,97.18
  vias: v1(2.54,103) v1(2.54,96.65) v1(2.54,90.3) v1(2.54,83.95) v1(2.54,77.6) v1(2.54,71.25) v1(2.54,64.9) v1(2.54,58.55) v1(2.54,52.2) v1(2.54,45.85) v1(2.54,39.5) v1(2.54,33.15) v1(2.54,26.8) v1(2.54,20.45) v1(2.54,14.1) v1(2.54,7.75) v1(8.89,103) v1(8.89,96.65) v1(8.89,90.3) v1(8.89,83.95) v1(8.89,71.25) v1(8.89,64.9) v1(8.89,58.55) v1(8.89,52.2) v1(8.89,45.85) v1(8.89,39.5) v1(8.89,33.15) v1(8.89,26.8) v1(8.89,20.45) v1(8.89,14.1) v1(8.89,7.75) v1(15.24,103) v1(15.24,96.65) v1(15.24,90.3) v1(15.24,71.25) v1(15.24,64.9) v1(15.24,58.55) v1(15.24,52.2) v1(15.24,45.85) v1(15.24,39.5) v1(15.24,33.15) v1(15.24,26.8) v1(15.24,20.45) v1(15.24,14.1) v1(15.24,7.75) v1(21.59,103) v1(21.59,96.65) v1(21.59,83.95) v1(21.59,71.25) v1(21.59,64.9) v1(21.59,58.55) v1(21.59,52.2) v1(21.59,45.85) v1(21.59,39.5) v1(21.59,33.15) v1(21.59,26.8) v1(21.59,20.45) v1(21.59,14.1) v1(21.59,7.75) v1(27.94,103) v1(27.94,96.65) v1(27.94,90.3) v1(27.94,83.95) v1(27.94,71.25) v1(27.94,64.9) v1(27.94,58.55) v1(27.94,52.2) v1(27.94,45.85) v1(27.94,39.5) v1(27.94,33.15) v1(27.94,26.8) v1(27.94,20.45) v1(27.94,14.1) v1(27.94,7.75) v1(34.29,103) v1(34.29,96.65) v1(34.29,90.3) v1(34.29,83.95) v1(34.29,64.9) v1(34.29,58.55) v1(34.29,52.2) v1(34.29,45.85) v1(34.29,39.5) v1(34.29,33.15) v1(34.29,26.8) v1(34.29,20.45) v1(34.29,14.1) v1(34.29,7.75) v1(40.64,103) v1(40.64,96.65) v1(46.99,103) v1(46.99,96.65) v1(46.99,90.3) v1(46.99,83.95) v1(46.99,64.9) v1(46.99,58.55) v1(46.99,52.2) v1(46.99,45.85) v1(46.99,39.5) v1(46.99,33.15) v1(46.99,26.8) v1(53.34,103) v1(53.34,96.65) v1(53.34,90.3) v1(53.34,83.95) v1(53.34,64.9) v1(53.34,45.85) v1(53.34,39.5) v1(53.34,33.15) v1(53.34,26.8) v1(53.34,14.1) v1(53.34,7.75) v1(59.69,103) v1(59.69,90.3) v1(59.69,83.95) v1(59.69,58.55) v1(59.69,52.2) v1(59.69,39.5) v1(59.69,33.15) v1(59.69,26.8) v1(59.69,14.1) v1(59.69,7.75) v1(66.04,103) v1(66.04,90.3) v1(66.04,83.95) v1(66.04,64.9) v1(66.04,58.55) v1(66.04,52.2) v1(66.04,45.85) v1(66.04,33.15) v1(66.04,26.8) v1(66.04,14.1) v1(66.04,7.75) v1(72.39,103) v1(72.39,90.3) v1(72.39,83.95) v1(72.39,77.6) v1(72.39,64.9) v1(72.39,58.55) v1(72.39,52.2) v1(72.39,39.5) v1(72.39,14.1) v1(72.39,7.75) v1(78.74,103) v1(78.74,90.3) v1(78.74,83.95) v1(78.74,77.6) v1(78.74,71.25) v1(78.74,26.8) v1(78.74,20.45) v1(78.74,7.75) v1(85.09,103) v1(85.09,90.3) v1(85.09,83.95) v1(85.09,77.6) v1(85.09,71.25) v1(85.09,64.9) v1(85.09,58.55) v1(85.09,52.2) v1(85.09,39.5) v1(85.09,33.15) v1(85.09,26.8) v1(85.09,20.45) v1(85.09,14.1) v1(85.09,7.75) v1(85.47,98.17) v1(91.44,103) v1(91.44,96.65) v1(91.44,90.3) v1(91.44,83.95) v1(91.44,77.6) v1(91.44,71.25) v1(91.44,64.9) v1(91.44,58.55) v1(91.44,52.2) v1(91.44,39.5) v1(91.44,33.15) v1(91.44,26.8) v1(91.44,20.45) v1(91.44,14.1) v1(91.44,7.75) v1(97.79,103) v1(97.79,96.65) v1(97.79,90.3) v1(97.79,83.95) v1(97.79,77.6) v1(97.79,71.25) v1(97.79,64.9) v1(97.79,52.2) v1(97.79,45.85) v1(97.79,39.5) v1(97.79,26.8) v1(97.79,20.45) v1(97.79,14.1) v1(97.79,7.75) v1(104.14,103) v1(104.14,96.65) v1(104.14,90.3) v1(104.14,83.95) v1(104.14,77.6) v1(104.14,71.25) v1(104.14,58.55) v1(104.14,52.2) v1(104.14,39.5) v1(104.14,33.15) v1(104.14,26.8) v1(104.14,20.45) v1(104.14,14.1) v1(104.14,7.75) v1(109.6,35.43) v1(110.49,90.3) v1(110.49,83.95) v1(110.49,77.6) v1(110.49,58.55) v1(110.49,52.2) v1(110.49,45.85) v1(110.49,39.5) v1(110.49,26.8) v1(110.49,20.45) v1(110.49,14.1) v1(110.49,7.75) v1(113.41,35.43) v1(116.84,103) v1(116.84,96.65) v1(116.84,77.6) v1(116.84,58.55) v1(116.84,52.2) v1(116.84,39.5) v1(116.84,26.8) v1(116.84,20.45) v1(116.84,14.1) v1(116.84,7.75) v1(117.22,35.43) v1(121.03,35.43) v1(123.19,103) v1(123.19,96.65) v1(123.19,90.3) v1(123.19,83.95) v1(123.19,77.6) v1(123.19,64.9) v1(123.19,52.2) v1(123.19,39.5) v1(123.19,26.8) v1(123.19,20.45) v1(123.19,14.1) v1(123.19,7.75) v1(124.84,35.43) v1(128.65,35.43) v1(129.54,103) v1(129.54,96.65) v1(129.54,90.3) v1(129.54,83.95) v1(129.54,58.55) v1(129.54,52.2) v1(129.54,39.5) v1(129.54,26.8) v1(129.54,20.45) v1(129.54,14.1) v1(129.54,7.75) v1(133.05,58.55) v1(135.89,103) v1(135.89,96.65) v1(135.89,90.3) v1(135.89,83.95) v1(135.89,71.25) v1(135.89,58.55) v1(135.89,45.85) v1(135.89,39.5) v1(135.89,26.8) v1(135.89,20.45) v1(135.89,14.1) v1(135.89,7.75) v1(138.81,34.16) v1(142.24,103) v1(142.24,96.65) v1(142.24,90.3) v1(142.24,83.95) v1(142.24,64.9) v1(142.24,58.55) v1(142.24,45.85) v1(142.24,39.5) v1(142.24,20.45) v1(142.24,14.1) v1(142.24,7.75) v1(148.59,103) v1(148.59,96.65) v1(148.59,90.3) v1(148.59,83.95) v1(148.59,77.6) v1(148.59,71.25) v1(148.59,64.9) v1(148.59,58.55) v1(148.59,52.2) v1(148.59,45.85) v1(148.59,39.5) v1(148.59,33.15) v1(148.59,20.45) v1(148.59,14.1) v1(148.59,7.75) v1(154.94,103) v1(154.94,96.65) v1(154.94,90.3) v1(154.94,83.95) v1(154.94,77.6) v1(154.94,71.25) v1(154.94,64.9) v1(154.94,58.55) v1(154.94,52.2) v1(154.94,45.85) v1(154.94,39.5) v1(154.94,33.15) v1(154.94,26.8) v1(154.94,20.45) v1(154.94,14.1) v1(154.94,7.75)
VIN_12V: length 13.6
  Bottom Layer w1: FH1.1 115.84,89.9 111.95,93.78 J8.1
BUCK_SW: length 18.1
  Top Layer w0.254: 127.52,63.91 128.16,64.55 136.11,64.55 137.03,63.63 L1.1 ; 127.52,63.91 D2.1 ; 127.52,63.91 127.52,64.46 129.29,66.23 U3.2
BUZZ_BASE: length 71.6
  Top Layer w0.254: R9.1 99.22,35.29 Q2.1 108.09,34.68 110.32,32.45 142.02,32.45 142.78,33.2 142.78,34.3 131.84,45.23 R5.2
BUZZ_NEG: length 50.2
  Top Layer w0.254: 106.09,36.24 139.02,36.24 141.56,33.7
  Bottom Layer w0.254: 141.56,33.7 149.42,25.85 D1.2
BUZZER_PA8: length 106.4
  Top Layer w0.254: R5.1 v1(114.16,45.23) ; v1(95.93,81.2) 50.72,81.2 J2.16
  Bottom Layer w0.254: v1(114.16,45.23) 114.16,62.97 v1(95.93,81.2)
I2C1_SCL: length 165.4
  Top Layer w0.224: v1(74.87,29.48) 74.68,29.29 U2.6 ; v1(63.21,80.23) 58.19,80.23 57.53,79.56 57.53,78.8 56.72,77.98 26.92,77.98 J2.7 ; U1.4 86.22,96.43 86.14,96.35 73.32,96.35 J5.3 ; J13.5 75.3,68.97 64.63,68.97 55.33,59.68 v1(53.11,59.68) 52.51,59.68 R1.2
  Bottom Layer w0.224: v1(53.11,59.68) 53.11,49.42 73.05,29.48 v1(74.87,29.48)
  Bottom Layer w0.254: 64.43,80.23 71.5,87.3 J5.3 ; 64.43,80.23 v1(63.21,80.23) ; 64.43,80.23 71.5,73.15 71.5,72.77 J13.5
I2C1_SDA: length 188.6
  Top Layer w0.224: v1(53.71,49.74) 52.79,49.74 R2.2 ; U1.1 83.52,98.17 J5.4 ; v1(75.95,29.49) U2.5 ; J13.6 77.41,69.4 64.11,69.4 v1(62.37,67.67) 34.69,67.67 J2.6
  Bottom Layer w0.224: 53.66,59.46 53.66,55.41 53.64,55.39 53.64,49.8 v1(53.71,49.74) 55.7,49.74 v1(75.95,29.49) 79.12,32.67 J13.6
  Bottom Layer w0.254: J5.4 74.04,72.77 J13.6
KEY1_PA0: length 39.7
  Top Layer w0.254: SW1.1 4.69,62.21 4.78,62.3 v1(5.35,62.3)
  Bottom Layer w0.254: J1.5 5.35,79.01 v1(5.35,62.3)
KEY2_PA1: length 51.3
  Top Layer w0.254: SW2.1 v1(5.51,51.19)
  Bottom Layer w0.254: v1(5.51,51.19) 16.89,62.57 16.89,88.01 J1.6
KEY3_PA2: length 57.8
  Top Layer w0.254: SW3.2 10.69,43.74 10.78,43.83 v1(11.35,43.83)
  Bottom Layer w0.254: v1(11.35,43.83) 19.56,52.04 19.56,88.14 J1.7
KEY4_PA3: length 70.5
  Top Layer w0.254: v1(10.69,32.02) SW4.2
  Bottom Layer w0.254: v1(10.69,32.02) 24.87,46.2 24.87,56.04 24.62,56.3 24.62,90.66 J1.8
LAMP_NEG: length 11.4
  Top Layer w1.016: Q1.3 106.44,52.56 J7.2
LED_GREEN_PB1: length 83.5
  Top Layer w0.254: v1(40.93,22.55) 39.17,22.55 38.24,21.62 38.24,15.27 R7.1
  Bottom Layer w0.254: v1(40.93,22.55) 42.29,23.91 42.29,93.09 J1.14
LED_RED_PB0: length 75.7
  Top Layer w0.254: v1(36.7,21.19) 37.3,21.19 R6.1
  Bottom Layer w0.254: J1.13 39.91,93.25 39.91,24.4 v1(36.7,21.19)
LED_YELLOW_PB10: length 91
  Top Layer w0.254: v1(36.67,8.1) 37.11,8.1 R8.1
  Bottom Layer w0.254: J1.15 44.83,93.09 44.83,23.05 36.67,14.89 v1(36.67,8.1)
LIGHT_ADC_PA4: length 95.2
  Top Layer w0.254: RL1.2 R10.1 84.16,45.39 87.87,45.39 C4.1
  Bottom Layer w0.254: RL1.2 61.35,61.31 61.35,78.73 54.99,85.09 54.99,94.82 54.2,95.61 32.11,95.61 J1.9
LIGHT_GATE: length 13.2
  Top Layer w0.254: Q1.1 105.59,46.8 R3.2 103.88,42.55 R4.1
LIGHT_PA11: length 95
  Top Layer w0.254: R3.1 v1(41.7,43.81)
  Bottom Layer w0.254: J2.13 41.02,44.49 v1(41.7,43.81)
RTC_VBAT: length 15.8
  Top Layer w0.254: U2.3 74.68,18.83 78.77,14.74 78.77,14.32 77.6,13.16 73.74,13.16 BT1.1
$1N72: length 6.4
  Top Layer w0.254: LED1.1 R6.2
$1N73: length 6.4
  Top Layer w0.254: R7.2 LED2.2
$1N74: length 6.4
  Top Layer w0.254: LED3.1 R8.2

## Copper pours and planes (outline as drawn; the poured copper is in the pictures)
GND on Top Layer: 0.51,105.03 157.48,105.03 157.48,0.51 0.51,0.51
GND on Bottom Layer: 0.51,105.03 157.48,105.03 157.48,0.51 0.51,0.51

## Text on the board
Document Layer: STM32 ENV MONITOR V1.2
Top Silkscreen Layer: STM32 ENV MONITOR V1.2  2026-11 | J5 OLED: 1:GND 2:3V3 3:SCL 4:SDA / J7: 1:12V 2:LED-   J8: DC 12V (center +) / J13: 1:3V3 2:5V 3:12V 4:GND 5:SCL 6:SDA / U1 GXHT30  U2 SD3077  U3 XL1509 5V / RL1 light->PA4   Program via board SWD
